# Altium project 1700-0003_PowerBoard_REV-A.PrjPcb
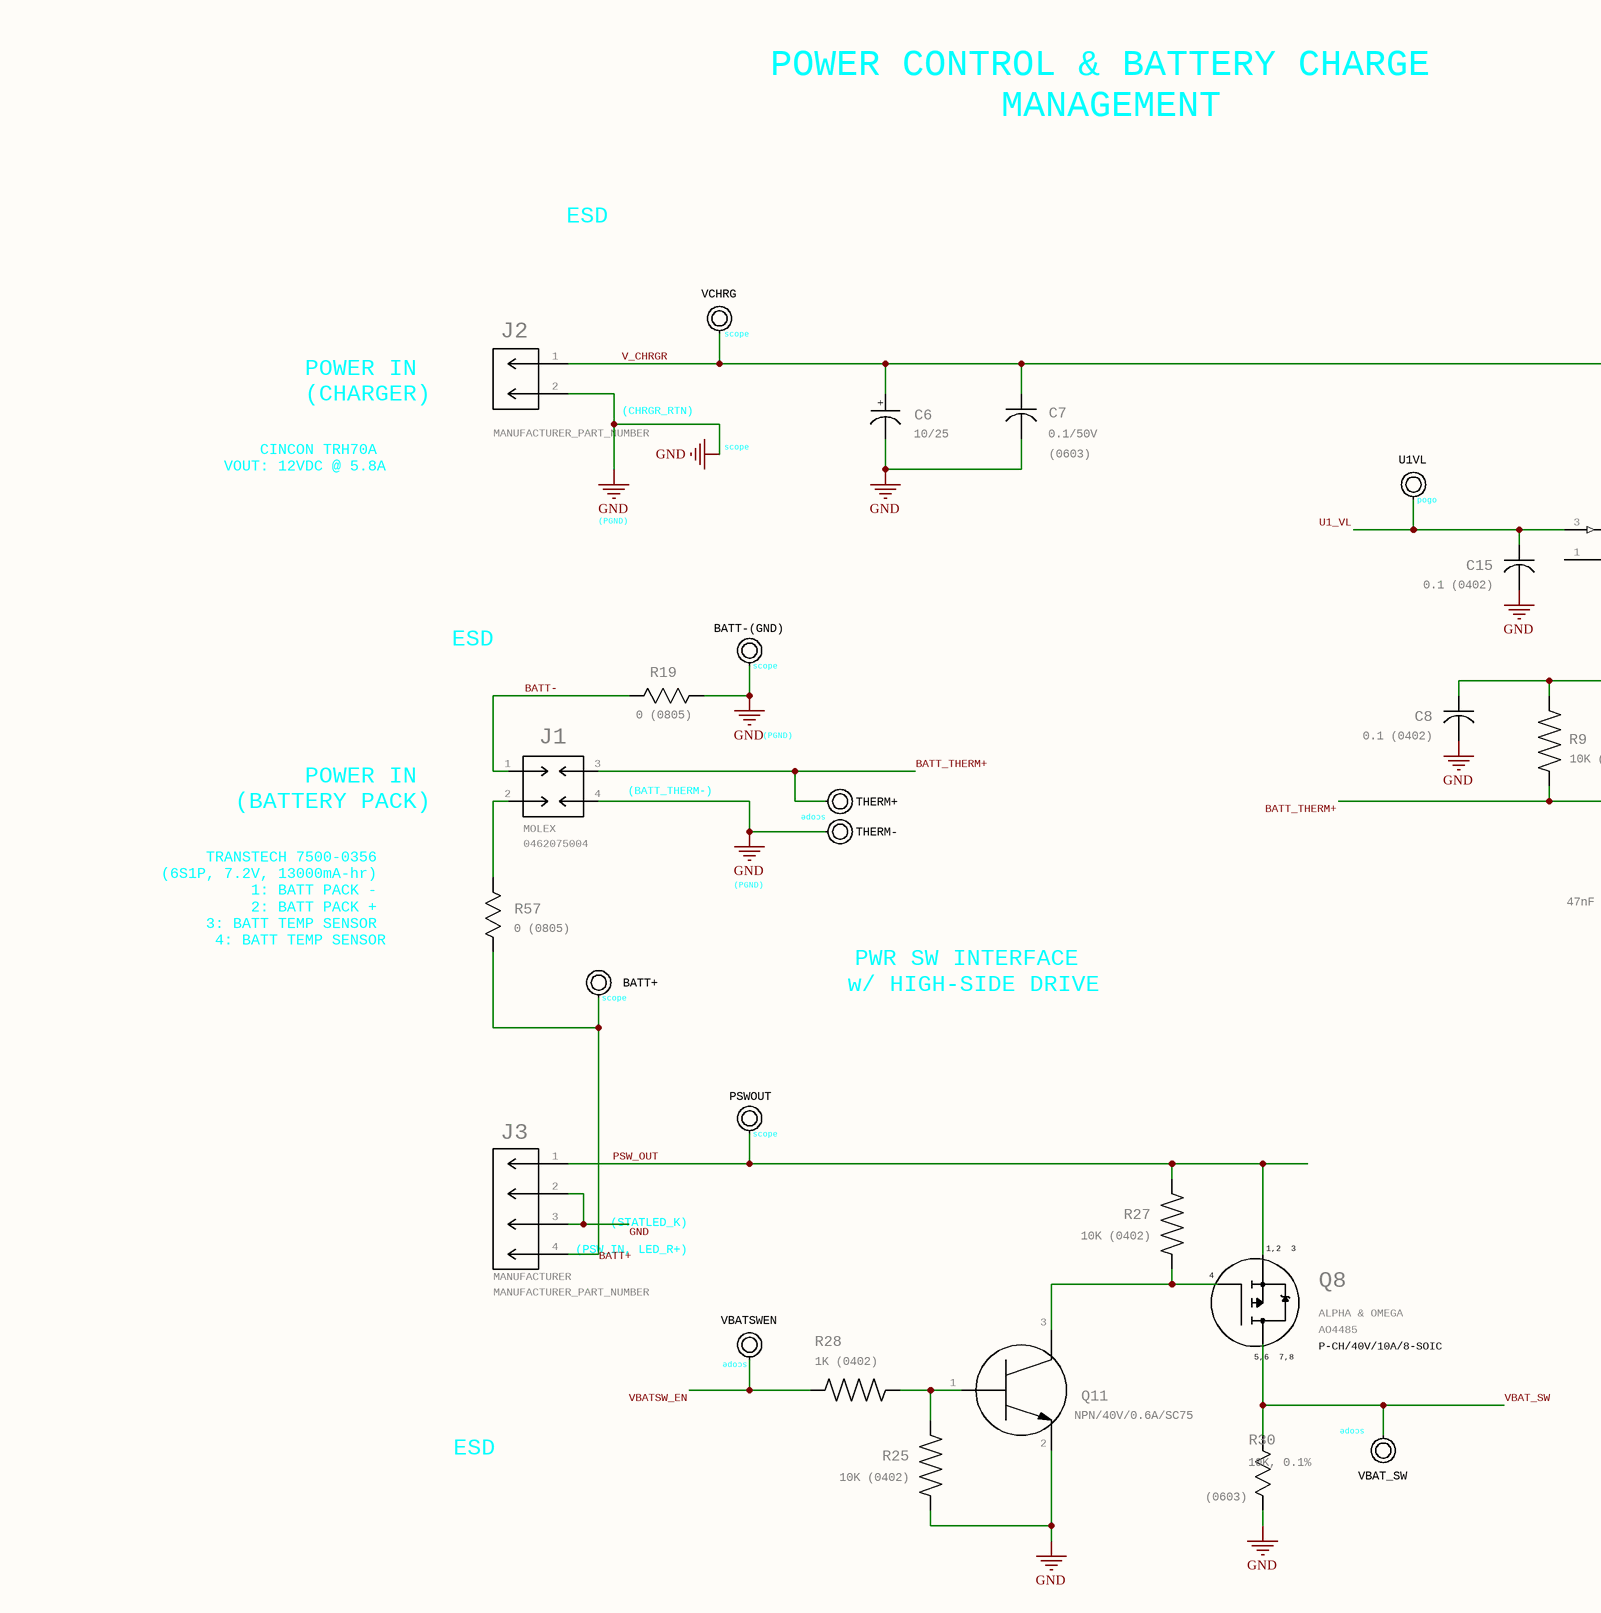
[diagram p0: 1700-0003_PowerBoard_REV-A_0.SchDoc, top left]
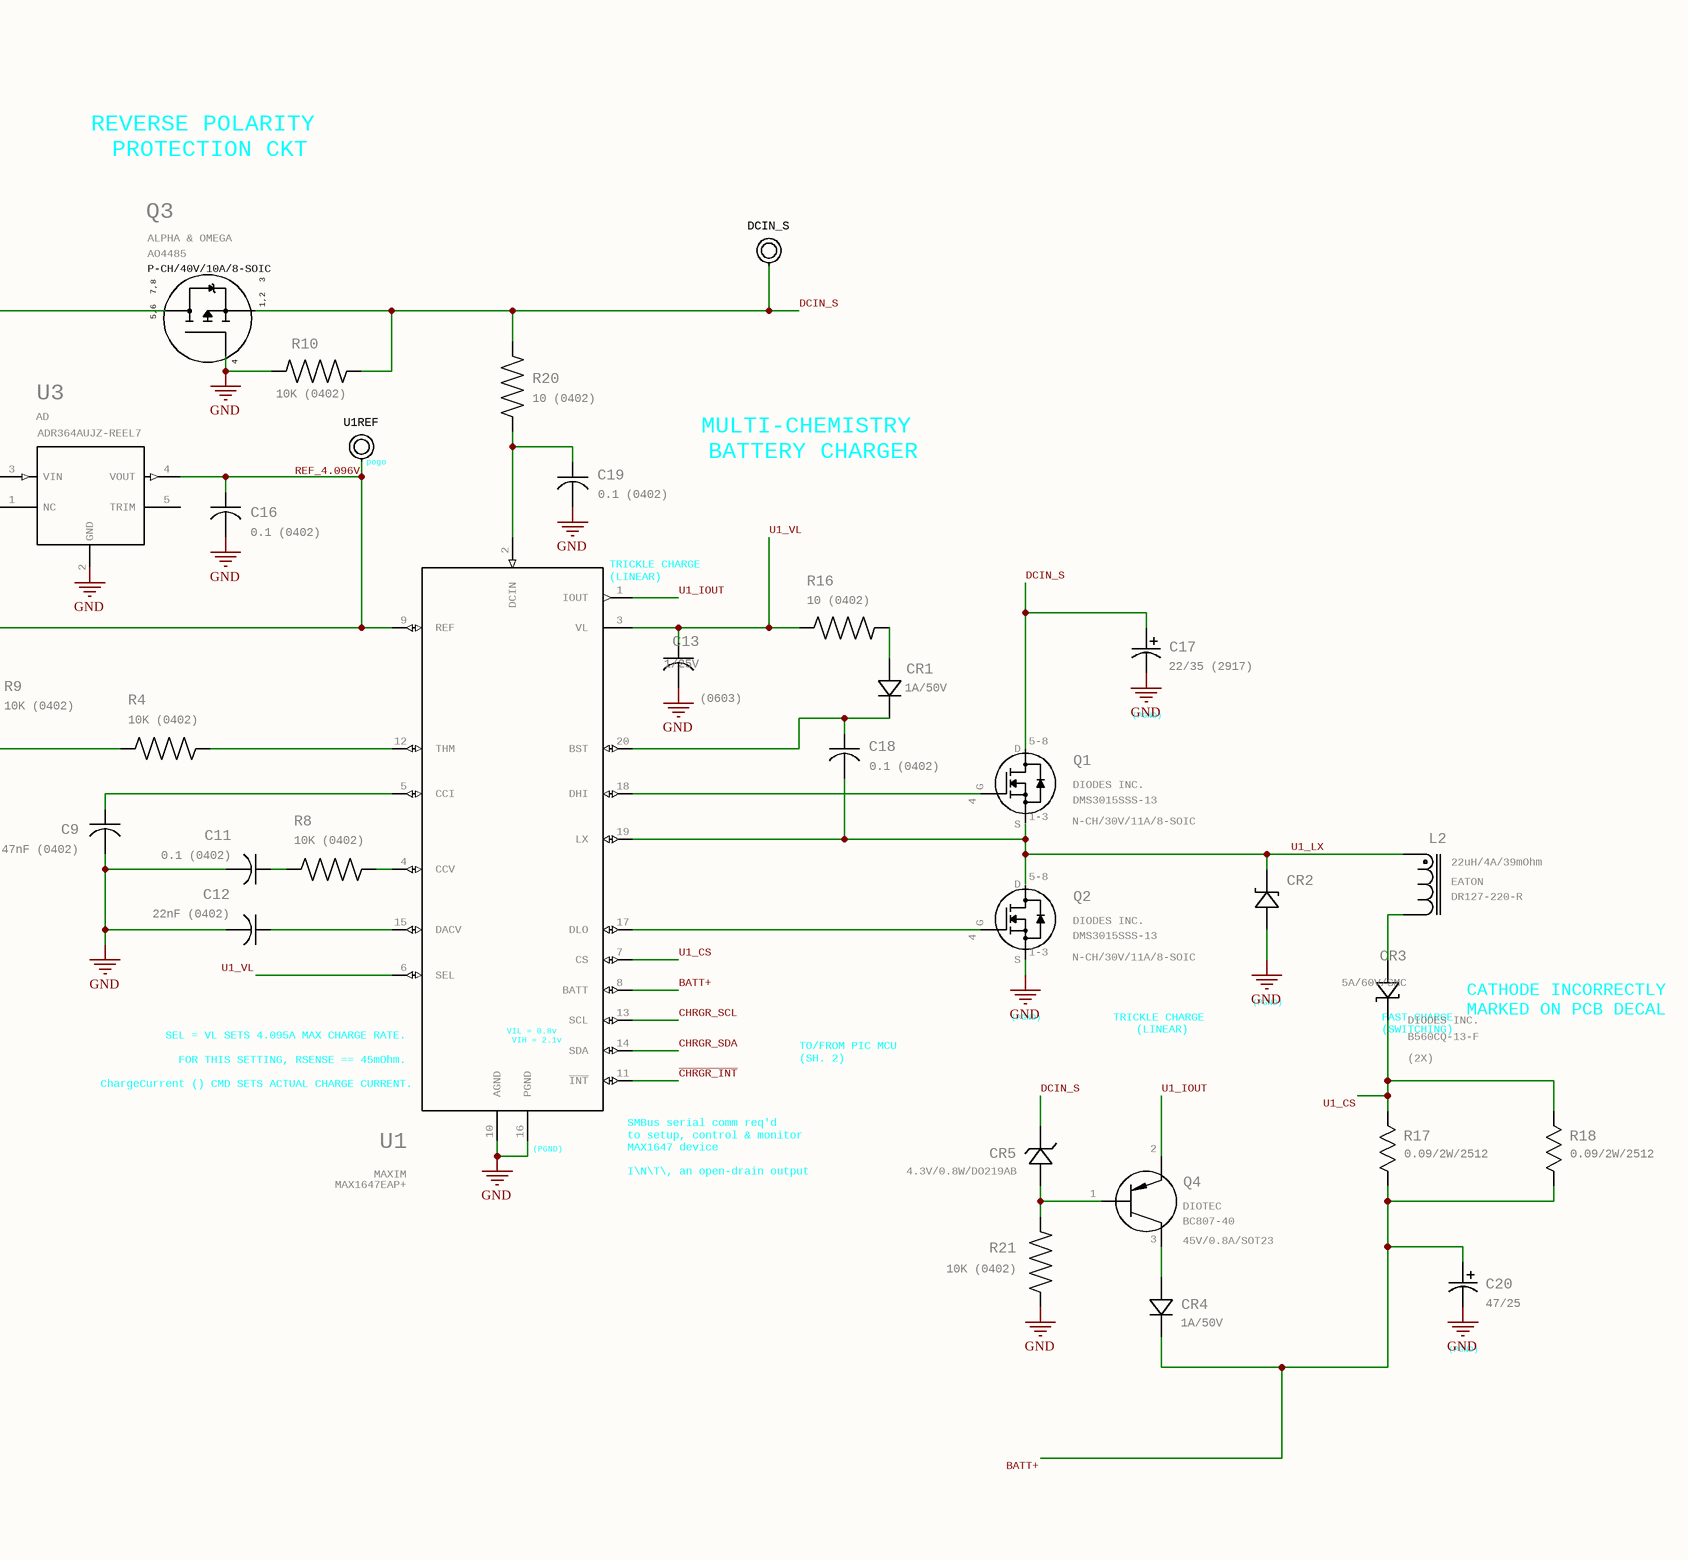
[diagram p1: 1700-0003_PowerBoard_REV-A_0.SchDoc, top middle]
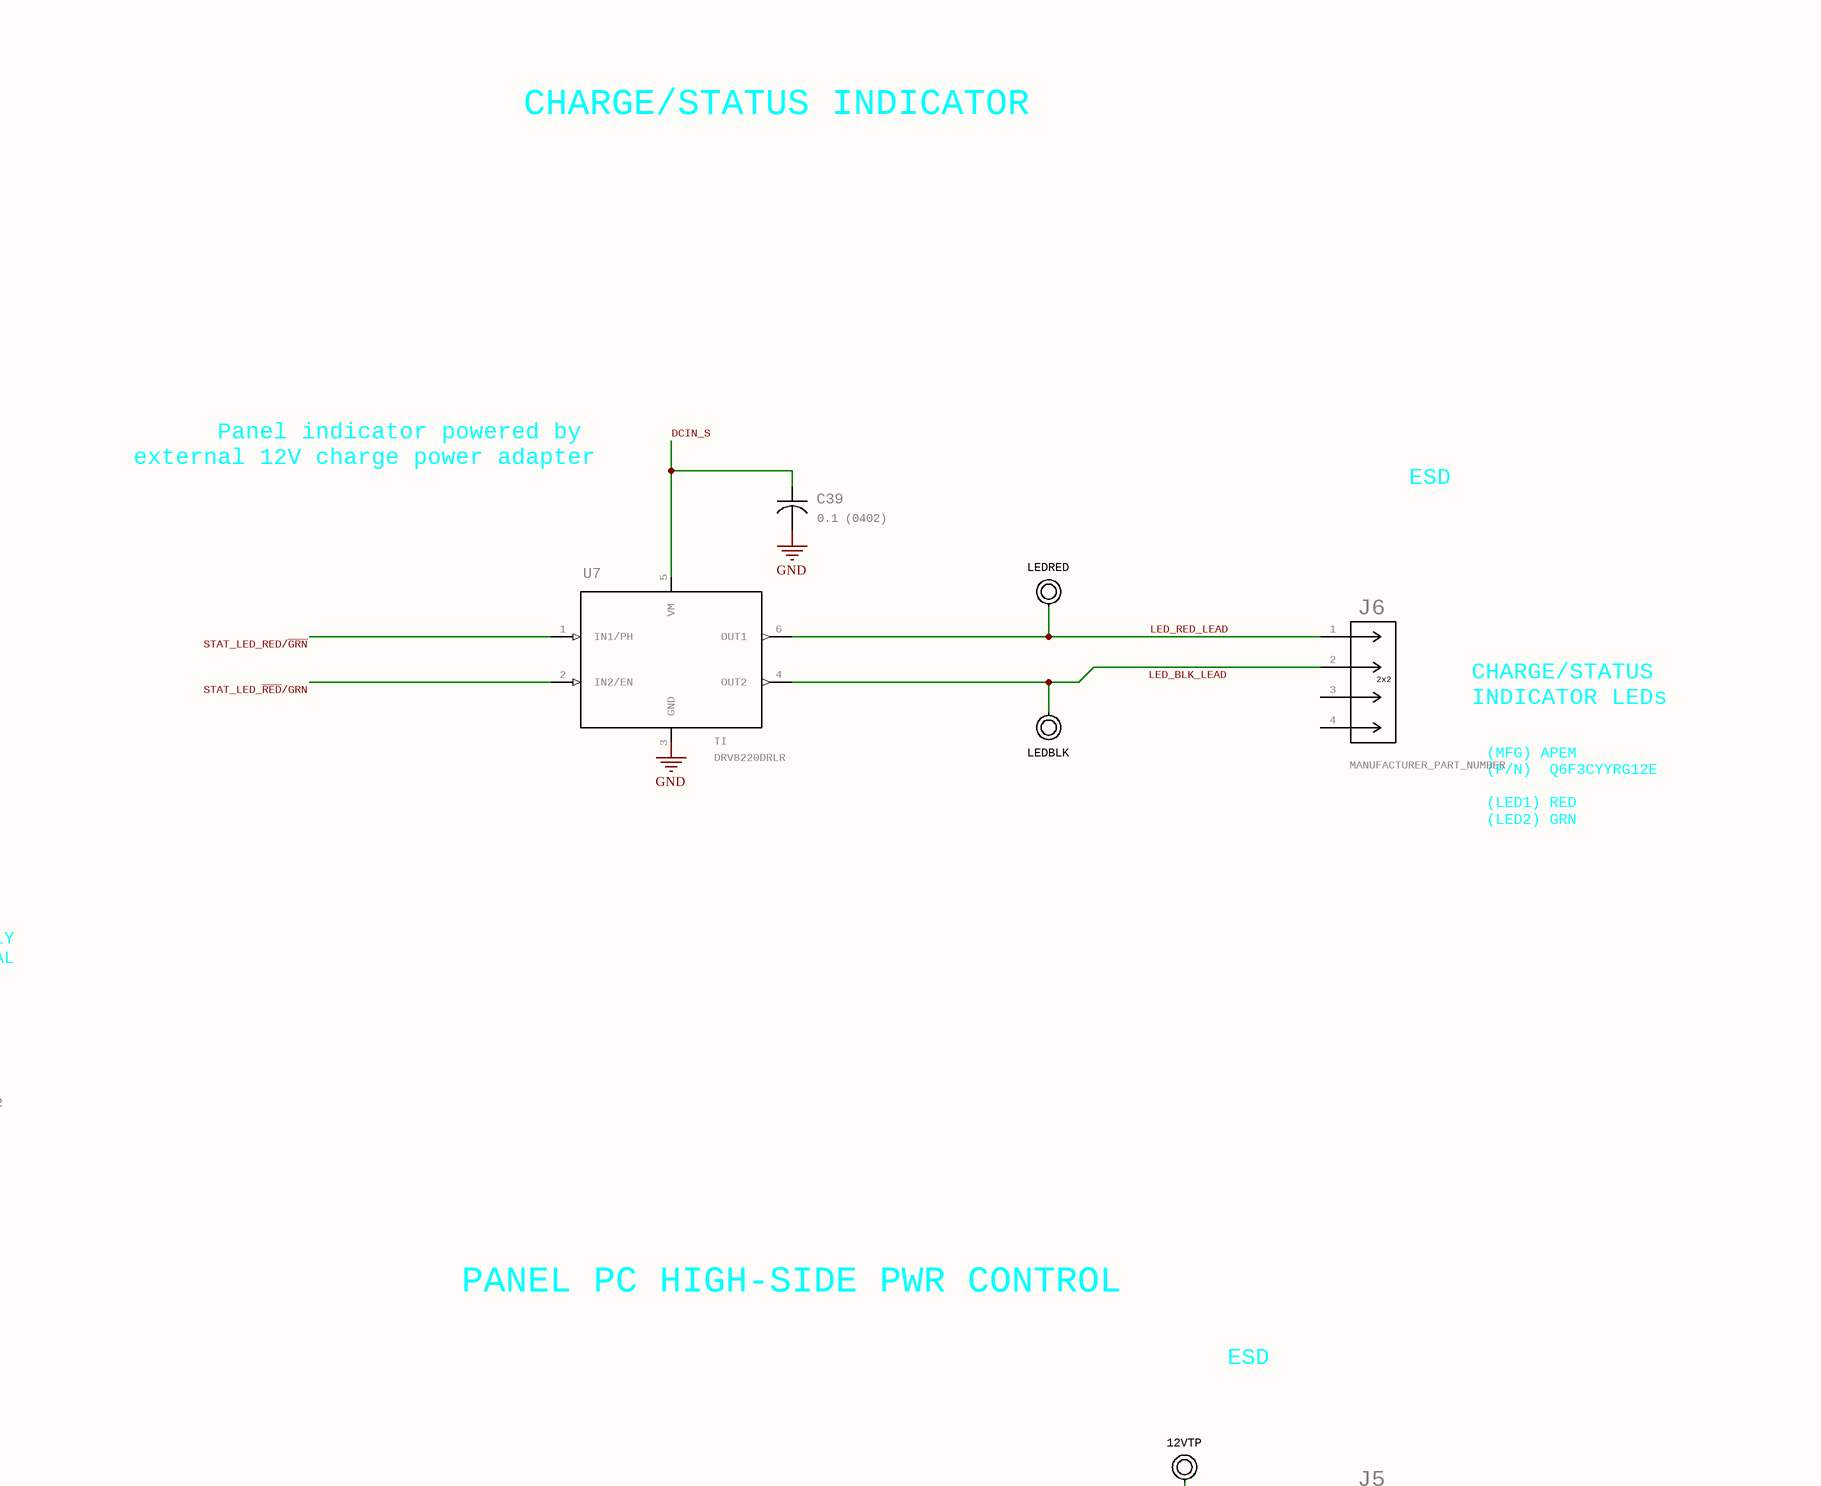
[diagram p2: 1700-0003_PowerBoard_REV-A_0.SchDoc, top right]
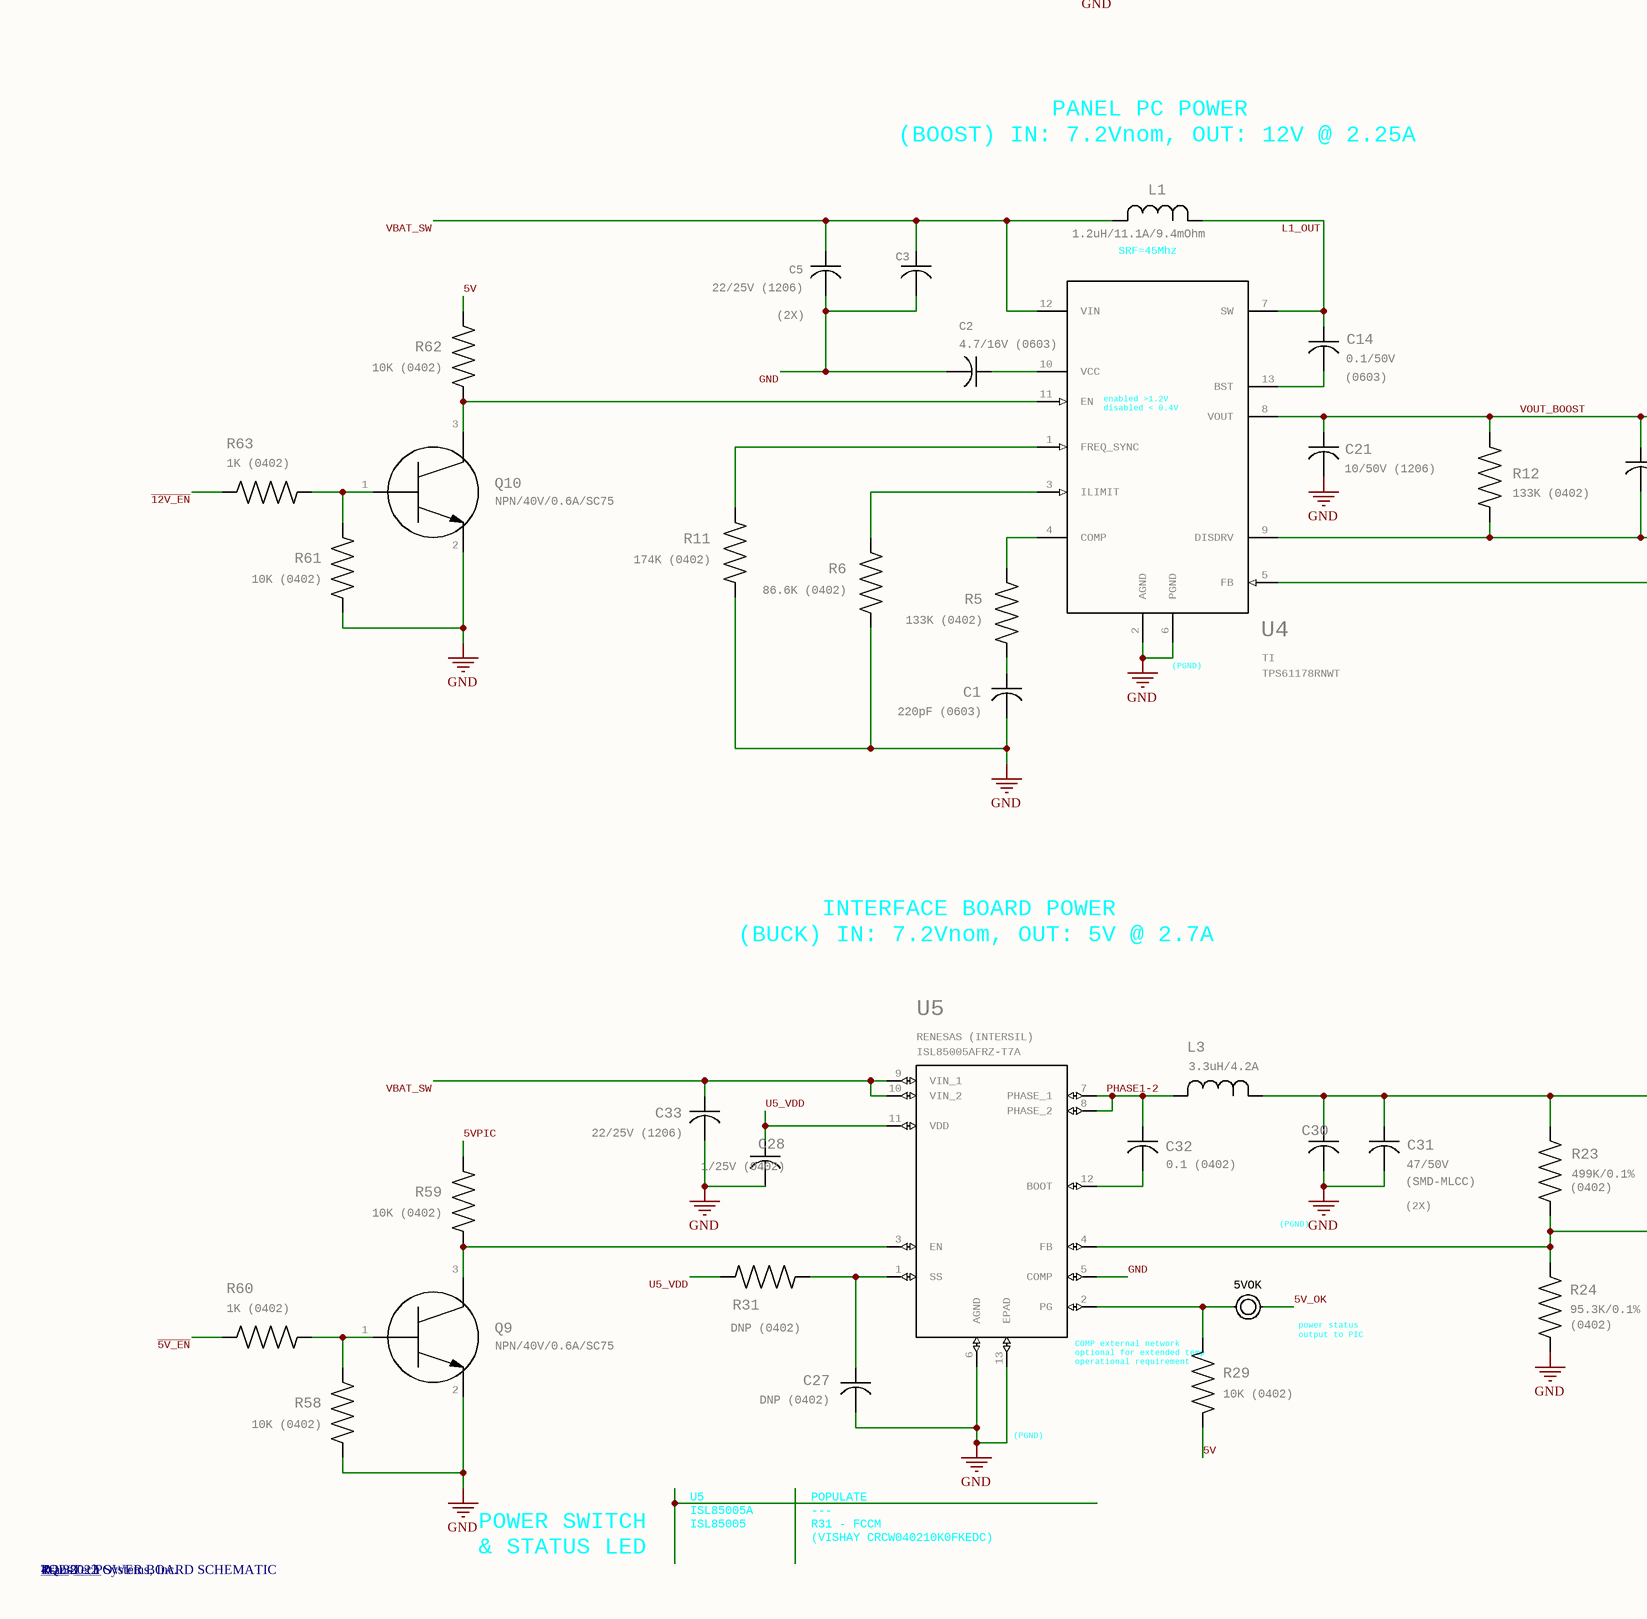
[diagram p3: 1700-0003_PowerBoard_REV-A_0.SchDoc, bottom left]
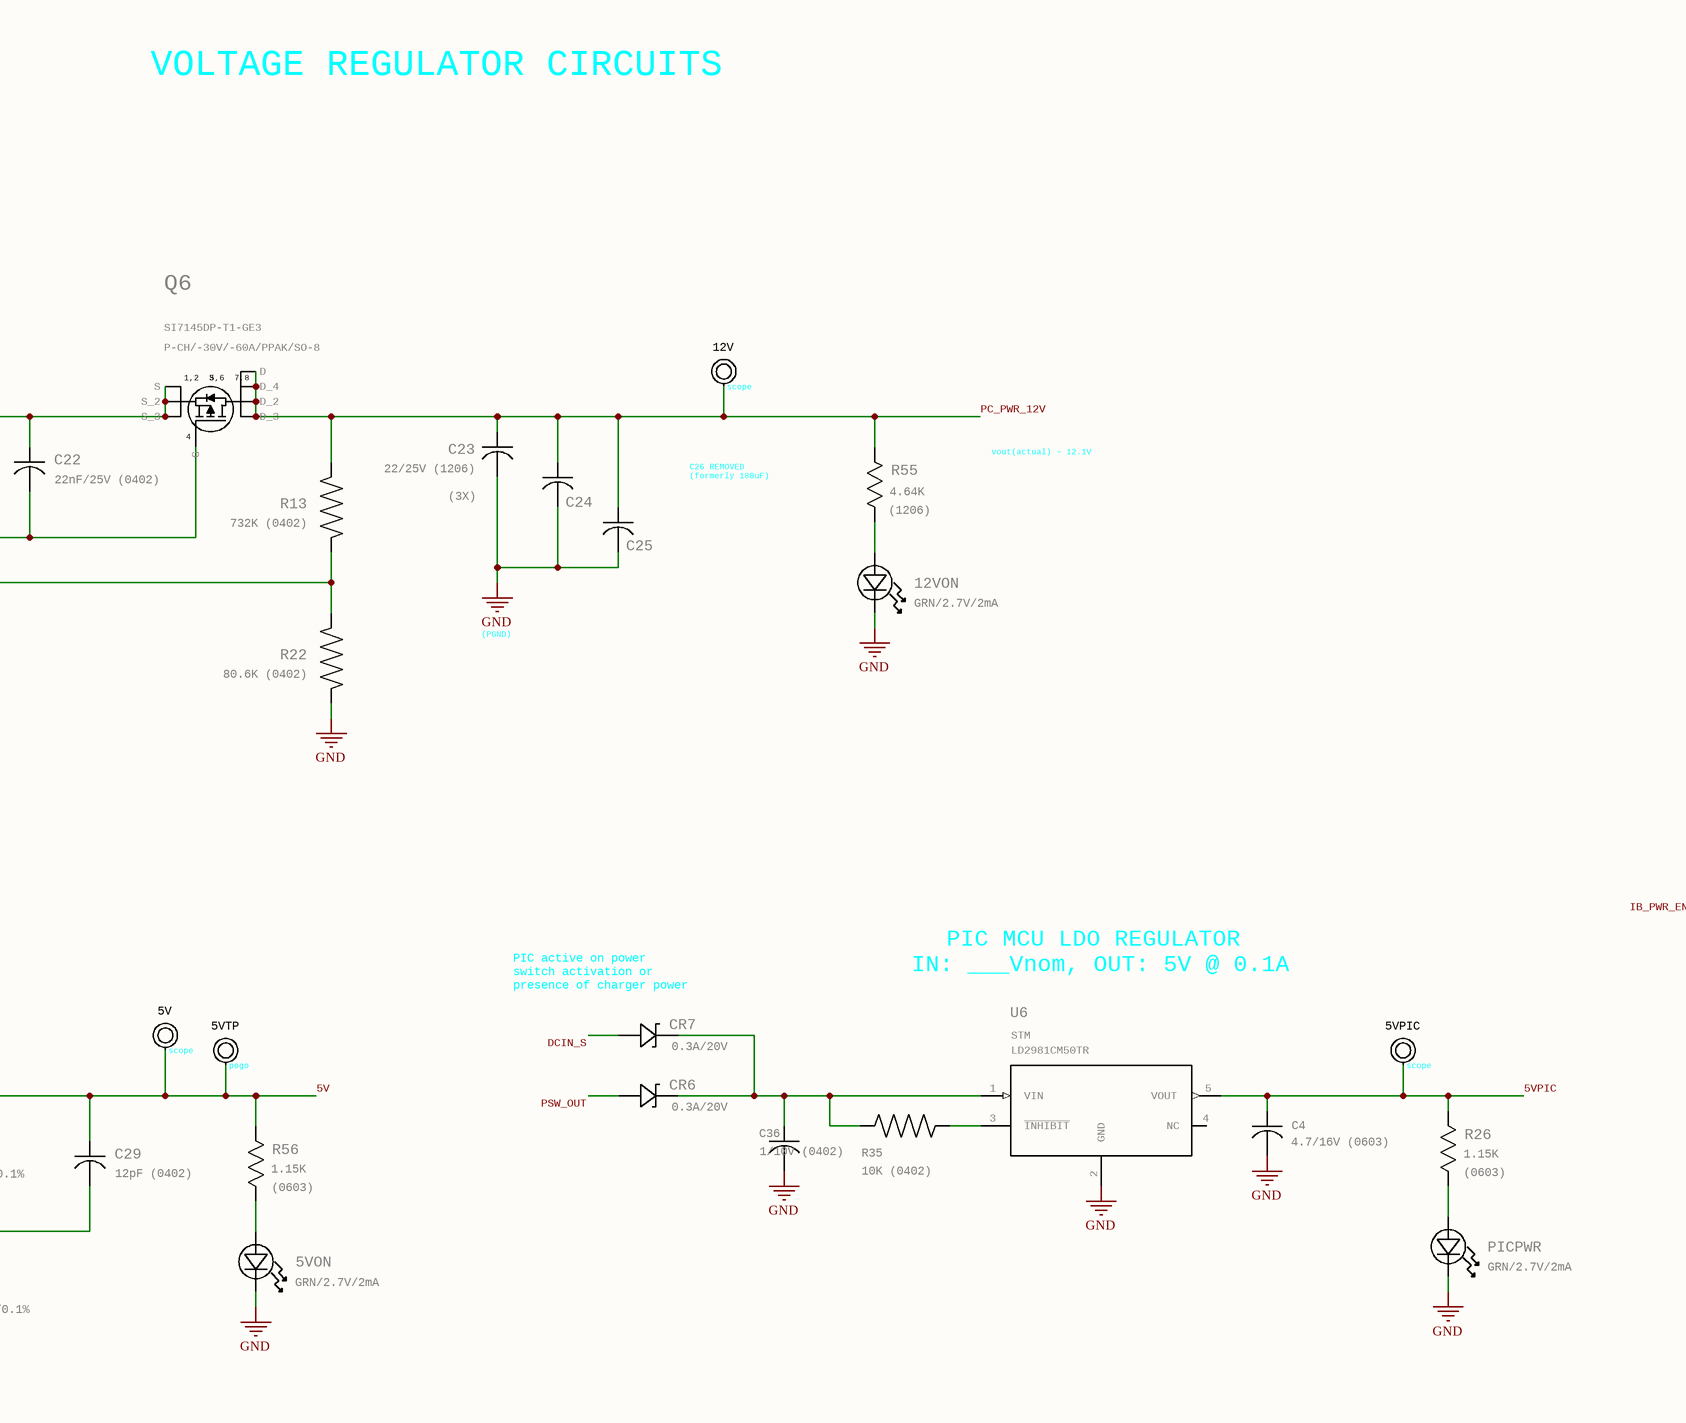
[diagram p4: 1700-0003_PowerBoard_REV-A_0.SchDoc, bottom middle]
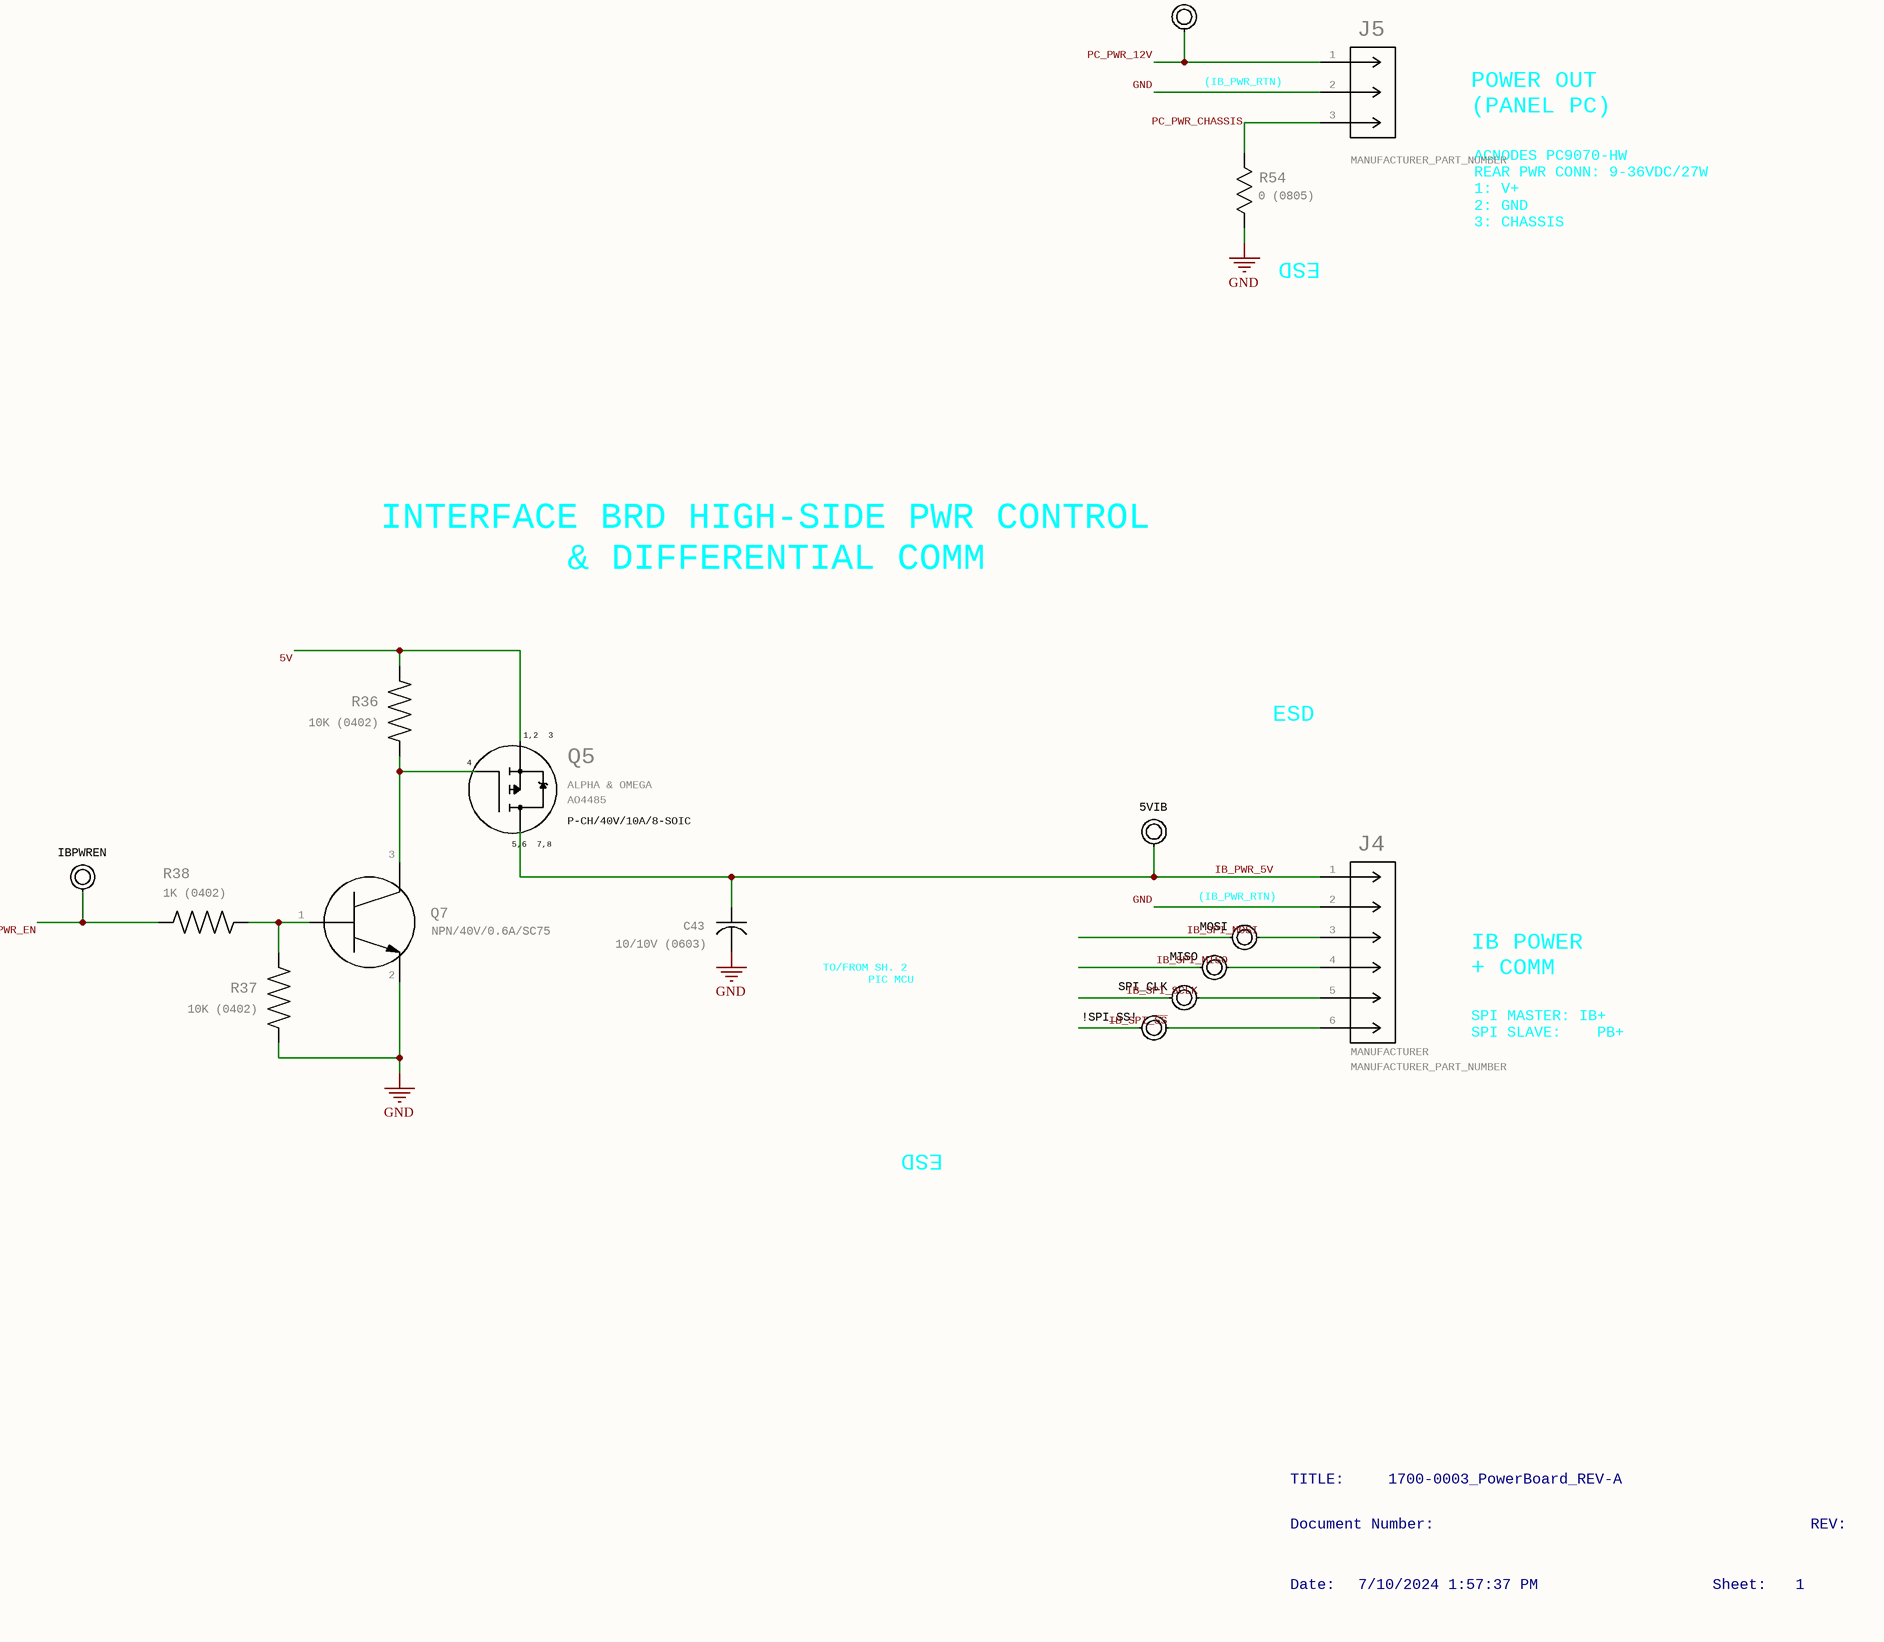
[diagram p5: 1700-0003_PowerBoard_REV-A_0.SchDoc, bottom right]
2 sheets, 204 parts. Net scope: global (net labels, ports and power ports of the same name join across sheets).
Board file: 1700-0003_PowerBoard_REV-A.PcbDoc
Sheets:
  1700-0003_PowerBoard_REV-A_0.SchDoc
  1700-0003_PowerBoard_REV-A_1.SchDoc

## Sheet 1700-0003_PowerBoard_REV-A_0.SchDoc: 1700-0003_PowerBoard_REV-A
size 897 x 577 mm; DRAWING_DATE: 4/15/2022; DRAWING_TITLE: PQI380 UNIV. INTERFACE BRD; PART_NUMBER: 7000-0303; REV: R12; Origin: Eagle; DWG-CO-NAME: DWG-CO-NAME; DWG-DATE: DWG-DATE; DWG-NUMBER: DWG-NUMBER; DWG-REV: DWG-REV; DWG-TITLE: DWG-TITLE; SIZE: SIZE; Date: 7/10/2024 1:57:37 PM; SheetNumber: 1; GateName_1: G$1; SymbolName_1: FRAME_D_L; LibraryName: frames; DeviceSetName: FRAME_D_L; GateName_2: G$2; SymbolName_2: DOCFIELD; Sheet: Sheet:

### Parts
5V  TST_POINT_PTH_042-OCT  [TST_POINT_PTH_042-OCT]  (value not drawn)
5VIB  TST_POINT_PTH_20X40MIL  [TST_POINT_PTH_20X40MIL]  (value not drawn)
5VOK  TST_POINT_PTH_20X40MIL_2PIN  [TST_POINT_PTH_20X40MIL_2PIN]  (value not drawn)
5VON  GRN/2.7V/2mA  [LED_DIALIGHT_598_DIA]
5VPIC  TST_POINT_PTH_042-OCT  [TST_POINT_PTH_042-OCT]  (value not drawn)
5VTP  TST_POINT_PTH_20X40MIL  [TST_POINT_PTH_20X40MIL]  (value not drawn)
12V  TST_POINT_PTH_042-OCT  [TST_POINT_PTH_042-OCT]  (value not drawn)
12VON  GRN/2.7V/2mA  [LED_DIALIGHT_598_DIA]
12VTP  TST_POINT_PTH_20X40MIL  [TST_POINT_PTH_20X40MIL]  (value not drawn)
!SPI_SS!  TST_POINT_PTH_042_2PIN  [TST_POINT_PTH_042-OCT_2PIN]  (value not drawn)
BATT+  TST_POINT_PTH_042-OCT  [TST_POINT_PTH_042-OCT]  (value not drawn)
BATT-(GND)  TST_POINT_PTH_042-OCT  [TST_POINT_PTH_042-OCT]  (value not drawn)
C1  220pF (0603)  [CAP_C1608_TDK]
C2  4.7/16V (0603)  [CAP_C1608_TDK]
C3  22/25V (1206)  [CAP_CL31_SAM]  (value not drawn)
C4  4.7/16V (0603)  [CAP_C1608_TDK]
C5  22/25V (1206)  QTY_AREA: (2X)  [CAP_CL31_SAM]
C6  10/25  [CAP_AFK106M25B12T-F_CND-L]
C7  0.1/50V  PACKAGE: (0603)  [CAP_C1608_TDK]
C8  0.1 (0402)  [G-155_MUR]
C9  47nF (0402)  [G-155_MUR]
C11  0.1 (0402)  [G-155_MUR]
C12  22nF (0402)  [G-155_MUR]
C13  1/25V  PACKAGE: (0603)  [CAP_C1608_TDK]
C14  0.1/50V  PACKAGE: (0603)  [CAP_C1608_TDK]
C15  0.1 (0402)  [G-155_MUR]
C16  0.1 (0402)  [G-155_MUR]
C17  22/35 (2917)  [CAPMP7.6X4.3_3.1N_KEM]
C18  0.1 (0402)  [G-155_MUR]
C19  0.1 (0402)  [G-155_MUR]
C20  47/25  [CAPMP7.6X4.3_3.1N_KEM]
C21  10/50V (1206)  [CAP_CL31_SAM]
C22  22nF/25V (0402)  [G-155_MUR]
C23  22/25V (1206)  QTY_AREA: (3X)  [CAP_CL31_SAM]
C24  22/25V (1206)  [CAP_CL31_SAM]  (value not drawn)
C25  22/25V (1206)  [CAP_CL31_SAM]  (value not drawn)
C27  DNP (0402)  [G-155_MUR]
C28  1/25V (0402)  [G-155_MUR]
C29  12pF (0402)  [G-155_MUR]
C30  47/50V (MLCC-SMD)  [CAP_CKG57N_TDK]  (value not drawn)
C31  47/50V  PACKAGE: (SMD-MLCC)  QTY_AREA: (2X)  [CAP_CKG57N_TDK]
C32  0.1 (0402)  [G-155_MUR]
C33  22/25V (1206)  [CAP_CL31_SAM]
C36  1/10V (0402)  [G-155_MUR]
C39  0.1 (0402)  [G-155_MUR]
C43  10/10V (0603)  [CAP_C1608_TDK]
CR1  1A/50V  [SMA_DIO]
CR2  5A/60V/SMC  [CR_0CQ-13-F_DIO]  (value not drawn)
CR3  5A/60V/SMC  MANUFACTURER: DIODES INC.  MANUFACTURER_PART_NUMBER: B560CQ-13-F  QTY_AREA: (2X)  [CR_0CQ-13-F_DIO]
CR4  1A/50V  [SMA_DIO]
CR5  4.3V/0.8W/DO219AB  [DIO_BZD27C4V3P_VIS]
CR6  0.3A/20V  [USC_TOS]
CR7  0.3A/20V  [USC_TOS]
DCIN_S  TST_POINT_PTH_042-OCT  [TST_POINT_PTH_042-OCT]  (value not drawn)
IBPWREN  TST_POINT_PTH_042-OCT  [TST_POINT_PTH_042-OCT]  (value not drawn)
J1  MANUFACTURER: MOLEX  MANUFACTURER_PART_NUMBER: 0462075004  [MOLEX_462075004]  (hidden comment: MOLEX_MINI-FIT-JR_462075004)
J2  MOLEX_NANO-FIT_1053111302  [CON_1053111302_MOL]  (value not drawn)
J3  MOLEX_NANO-FIT_1053111304  [CON_1053111304_MOL]  (value not drawn)
J4  MOLEX_1053111206  [CON_1053111206_MOL]  (value not drawn)
J5  MOLEX_NANO-FIT_1053111303  [CON_1053111303_MOL]  (value not drawn)
J6  CON_MOLEX_NANOFIT_1053121304  [CON_1053121304]  (value not drawn)
L1  1.2uH/11.1A/9.4mOhm  [IND_XAL50XX_COC]
L2  22uH/4A/39mOhm  MANUFACTURER: EATON  MANUFACTURER_PART_NUMBER: DR127-220-R  [DR127]
L3  3.3uH/4.2A  [IND_CB_DRA74]
LEDBLK  TST_POINT_PTH_20X40MIL  [TST_POINT_PTH_20X40MIL]  (value not drawn)
LEDRED  TST_POINT_PTH_20X40MIL  [TST_POINT_PTH_20X40MIL]  (value not drawn)
MISO  TST_POINT_PTH_042_2PIN  [TST_POINT_PTH_042-OCT_2PIN]  (value not drawn)
MOSI  TST_POINT_PTH_042_2PIN  [TST_POINT_PTH_042-OCT_2PIN]  (value not drawn)
PICPWR  GRN/2.7V/2mA  [LED_DIALIGHT_598_DIA]
PSWOUT  TST_POINT_PTH_042-OCT  [TST_POINT_PTH_042-OCT]  (value not drawn)
Q1  N-CH/30V/11A/8-SOIC  MANUFACTURER: DIODES INC.  MANUFACTURER_PART_NUMBER: DMS3015SSS-13  [SOIC127P600X175-8N]
Q2  N-CH/30V/11A/8-SOIC  MANUFACTURER: DIODES INC.  MANUFACTURER_PART_NUMBER: DMS3015SSS-13  [SOIC127P600X175-8N]
Q3  P-CH/40V/10A/8-SOIC  5,6
7,8: 5,6 / 7,8  1,2
3: 1,2 / 3  MANUFACTURER: ALPHA & OMEGA  MANUFACTURER_PART_NUMBER: AO4485  [SOIC127P600X175-8N]
Q4  45V/0.8A/SOT23  MANUFACTURER: DIOTEC  MANUFACTURER_PART_NUMBER: BC807-40  [SOT-23-3_DIOTEC]
Q5  P-CH/40V/10A/8-SOIC  5,6
7,8: 5,6 / 7,8  1,2
3: 1,2 / 3  MANUFACTURER: ALPHA & OMEGA  MANUFACTURER_PART_NUMBER: AO4485  [SOIC127P600X175-8N]
Q6  P-CH/-30V/-60A/PPAK/SO-8  5,6
7,8: 5,6 / 7,8  1,2
3: 1,2 / 3  MANUFACTURER_PART_NUMBER: SI7145DP-T1-GE3  [SON8_SI7135DP-T1-GE3_VIS]
Q7  NPN/40V/0.6A/SC75  [SC-75(SOT-416)_ONSEMI]
Q8  P-CH/40V/10A/8-SOIC  5,6
7,8: 5,6 / 7,8  1,2
3: 1,2 / 3  MANUFACTURER: ALPHA & OMEGA  MANUFACTURER_PART_NUMBER: AO4485  [SOIC127P600X175-8N]
Q9  NPN/40V/0.6A/SC75  [SC-75(SOT-416)_ONSEMI]
Q10  NPN/40V/0.6A/SC75  [SC-75(SOT-416)_ONSEMI]
Q11  NPN/40V/0.6A/SC75  [SC-75(SOT-416)_ONSEMI]
R4  10K (0402)  [RESC1005X35N]
R5  133K (0402)  [RESC1005X35N]
R6  86.6K (0402)  [RESC1005X35N]
R8  10K (0402)  [RESC1005X35N]
R9  10K (0402)  [RESC1005X35N]
R10  10K (0402)  [RESC1005X35N]
R11  174K (0402)  [RESC1005X35N]
R12  133K (0402)  [RESC1005X35N]
R13  732K (0402)  [RESC1005X35N]
R16  10 (0402)  [RESC1005X35N]
R17  0.09/2W/2512  [RES_2512_TECONN]
R18  0.09/2W/2512  [RES_2512_TECONN]
R19  0 (0805)  [STA_HCJ0805_STP]
R20  10 (0402)  [RESC1005X35N]
R21  10K (0402)  [RESC1005X35N]
R22  80.6K (0402)  [RESC1005X35N]
R23  499K/0.1%  PACKAGE: (0402)  [RESC1005X35N]
R24  95.3K/0.1%  PACKAGE: (0402)  [RESC1005X35N]
R25  10K (0402)  [RESC1005X35N]
R26  1.15K  PACKAGE: (0603)  [STA_RMCF0603_STP]
R27  10K (0402)  [RESC1005X35N]
R28  1K (0402)  [RESC1005X35N]
R29  10K (0402)  [RESC1005X35N]
R30  10K, 0.1%  PACKAGE: (0603)  [STA_RMCF0603_STP]
R31  DNP (0402)  [RESC1005X35N]
R35  10K (0402)  [RESC1005X35N]
R36  10K (0402)  [RESC1005X35N]
R37  10K (0402)  [RESC1005X35N]
R38  1K (0402)  [RESC1005X35N]
R54  0 (0805)  [STA_HCJ0805_STP]
R55  4.64K  PACKAGE: (1206)  [RC1206N_YAG]
R56  1.15K  PACKAGE: (0603)  [STA_RMCF0603_STP]
R57  0 (0805)  [STA_HCJ0805_STP]
R58  10K (0402)  [RESC1005X35N]
R59  10K (0402)  [RESC1005X35N]
R60  1K (0402)  [RESC1005X35N]
R61  10K (0402)  [RESC1005X35N]
R62  10K (0402)  [RESC1005X35N]
R63  1K (0402)  [RESC1005X35N]
SPI_CLK  TST_POINT_PTH_042_2PIN  [TST_POINT_PTH_042-OCT_2PIN]  (value not drawn)
THERM+  TST_POINT_PTH_042-OCT  [TST_POINT_PTH_042-OCT]  (value not drawn)
THERM-  TST_POINT_PTH_042-OCT  [TST_POINT_PTH_042-OCT]  (value not drawn)
U1  MANUFACTURER: MAXIM  [21-0056C_20_MXM]  (hidden comment: MAX1647EAP+)
U1REF  TST_POINT_PTH_20X40MIL  [TST_POINT_PTH_20X40MIL]  (value not drawn)
U1VL  TST_POINT_PTH_20X40MIL  [TST_POINT_PTH_20X40MIL]  (value not drawn)
U3  MANUFACTURER: AD  MANUFACTURER_PART_NUMBER: ADR364AUJZ-REEL7  [UJ_5_ADI]  (hidden comment: AD_REFERENCE_ADR364AUJZ-REEL7)
U4  MANUFACTURER: TI  MANUFACTURER_PART_NUMBER: TPS61178RNWT  [RNW0013A]  (hidden comment: REGULATOR_BOOST_TI_TPS61178RNWT)
U5  MANUFACTURER: RENESAS (INTERSIL)  MANUFACTURER_PART_NUMBER: ISL85005AFRZ-T7A  [SON50P300X400X90-13N]  (hidden comment: REGULATOR_BUCK_RENESAS_ISL85005AFRZ-T7A)
U6  MANUFACTURER: STM  MANUFACTURER_PART_NUMBER: LD2981CM50TR  [SOT23-5L_STM]  (hidden comment: IC_LDO_STM_LD2981CM50TR)
U7  MANUFACTURER: TI  MANUFACTURER_PART_NUMBER: DRV8220DRLR  [SOT5X3-6_DRL_TEX]  (hidden comment: IC_H-BRIDGE_TI_DRV8220DRLR)
VBAT_SW  TST_POINT_PTH_042-OCT  [TST_POINT_PTH_042-OCT]  (value not drawn)
VBATSWEN  TST_POINT_PTH_042-OCT  [TST_POINT_PTH_042-OCT]  (value not drawn)
VCHRG  TST_POINT_PTH_042-OCT  [TST_POINT_PTH_042-OCT]  (value not drawn)

### Nets
GND: 5VON.1 12VON.1 BATT-(GND).P$1 C1.2 C2.2 C3.2 C4.2 C5.2 C6.2 C7.2 C8.2 C9.2 C11.2 C12.2 C13.2 C15.2 C16.2 C17.2 C19.2 C20.2 C21.2 C23.2 C24.2 C25.2 C27.2 C28.2 C30.2 C31.2 C33.2 C36.2 C39.2 C43.2 CR2.1(A) J1.4 J2.2 J3.2 J3.3 J4.2 J5.2 PICPWR.1 Q2.1-3(S) Q3.4(G) Q7.2(E) Q9.2(E) Q10.2(E) Q11.2(E) R6.2 R10.1 R11.2 R19.1 R21.2 R22.2 R24.2 R25.1 R30.2 R37.1 R54.2 R58.1 R61.1 THERM-.P$1 U1.10(AGND) U1.16(PGND) U3.2(GND) U4.2(AGND) U4.6(PGND) U5.5(COMP) U5.6(AGND) U5.13(EPAD) U6.2(GND) U7.3(GND)
~{12V_EN}: R63.1
~{5V_EN}: R60.1
5V: 5V.P$1 5VTP.P$1 C29.1 C30.1 C31.1 L3.1 Q5.1-3(S) R23.1 R29.1 R36.2 R56.2 R62.2
5V_OK: 5VOK.P$1
5VPIC: 5VPIC.P$1 C4.1 R26.2 R59.2 U6.5(VOUT)
BATT+: BATT+.P$1 C20.1 CR4.1 J3.4 R17.2 R18.2 R57.1 U1.8(BATT)
BATT-: J1.1 R19.2
BATT_THERM+: J1.3 R4.1 R9.2 THERM+.P$1
~{CHRGR_INT}: U1.11(~{INT})
CHRGR_SCL: U1.13(SCL)
CHRGR_SDA: U1.14(SDA)
DCIN_S: C17.1 C39.1 CR5.2(K) CR7.2(A) DCIN_S.P$1 Q1.5-8(D) Q3.1-3(S) R10.2 R20.2 U7.5(VM)
IB_PWR_5V: 5VIB.P$1 C43.1 J4.1 Q5.5-8(D)
IB_PWR_EN: IBPWREN.P$1 R38.1
IB_SPI_MISO: J4.4 MISO.P$1
IB_SPI_MOSI: J4.3 MOSI.P$1
IB_SPI_~{SS}: !SPI_SS!.P$1 J4.6
IB_SPI_SCLK: J4.5 SPI_CLK.P$1
L1_OUT: C14.1 L1.1 U4.7(SW)
LED_BLK_LEAD: J6.2 LEDBLK.P$1 U7.4(OUT2)
LED_RED_LEAD: J6.1 LEDRED.P$1 U7.6(OUT1)
PC_PWR_12V: 12V.P$1 12VTP.P$1 C23.1 C24.1 C25.1 J5.1 Q6.5(D_3) Q6.6(D_2) Q6.7(D_4) Q6.8(D) R13.1 R55.1
PC_PWR_CHASSIS: J5.3 R54.1
PHASE1-2: C32.1 L3.2 U5.7(PHASE_1) U5.8(PHASE_2)
PSW_OUT: CR6.2(A) J3.1 PSWOUT.P$1 Q8.1-3(S) R27.2
REF_4.096V: C8.1 C16.1 R9.1 U1.9(REF) U1REF.P$1 U3.4(VOUT)
STAT_LED_~{RED}/GRN: U7.2(IN2/EN)
STAT_LED_RED/~{GRN}: U7.1(IN1/PH)
U1_CS: CR3.2(K) R17.1 R18.1 U1.7(CS)
U1_IOUT: Q4.2(E) U1.1(IOUT)
U1_LX: C18.2 CR2.2(K) L2.1 Q1.1-3(S) Q2.5-8(D) U1.19(LX)
U1_VL: C13.1 C15.1 R16.1 U1.3(VL) U1.6(SEL) U1VL.P$1 U3.3(VIN)
U5_VDD: C28.1 R31.1 U5.11(VDD)
V_CHRGR: C6.1 C7.1 J2.1 Q3.5-8(D) VCHRG.P$1
VBAT_SW: C3.1 C5.1 C33.1 L1.2 Q8.5-8(D) R30.1 U4.12(VIN) U5.9(VIN_1) U5.10(VIN_2) VBAT_SW.P$1
VBATSW_EN: R28.1 VBATSWEN.P$1
VOUT_BOOST: C21.1 C22.1 Q6.1(S_3) Q6.2(S_2) Q6.3(S) R12.1 U4.8(VOUT)
Net5VOK_P$2: 5VOK.P$2 R29.2 U5.2(PG)
Net5VON_2: 5VON.2 R56.1
Net12VON_2: 12VON.2 R55.2
NetC1_1: C1.1 R5.2
NetC2_1: C2.1 U4.10(VCC)
NetC9_1: C9.1 U1.5(CCI)
NetC11_1: C11.1 R8.1
NetC12_1: C12.1 U1.15(DACV)
NetC14_2: C14.2 U4.13(BST)
NetC18_1: C18.1 CR1.1 U1.20(BST)
NetC19_1: C19.1 R20.1 U1.2(DCIN)
NetC22_2: C22.2 Q6.4(G) R12.2 U4.9(DISDRV)
NetC27_1: C27.1 R31.2 U5.1(SS)
NetC29_2: C29.2 R23.2 R24.1 U5.4(FB)
NetC32_2: C32.2 U5.12(BOOT)
NetC36_1: C36.1 CR6.1(K) CR7.1(K) R35.2 U6.1(VIN)
NetCR1_2: CR1.2 R16.2
NetCR3_1: CR3.1(A) L2.2
NetCR4_2: CR4.2 Q4.3(C)
NetCR5_1: CR5.1(A) Q4.1(B) R21.1
NetJ1_2: J1.2 R57.2
NetPICPWR_2: PICPWR.2 R26.1
NetQ1_4: Q1.4(G) U1.18(DHI)
NetQ2_4: Q2.4(G) U1.17(DLO)
NetQ5_4: Q5.4(G) Q7.3(C) R36.1
NetQ7_1: Q7.1(B) R37.2 R38.2
NetQ8_4: Q8.4(G) Q11.3(C) R27.1
NetQ9_1: Q9.1(B) R58.2 R60.2
NetQ9_3: Q9.3(C) R59.1 U5.3(EN)
NetQ10_1: Q10.1(B) R61.2 R63.2
NetQ10_3: Q10.3(C) R62.1 U4.11(EN)
NetQ11_1: Q11.1(B) R25.2 R28.2
NetR4_2: R4.2 U1.12(THM)
NetR5_1: R5.1 U4.4(COMP)
NetR6_1: R6.1 U4.3(ILIMIT)
NetR8_2: R8.2 U1.4(CCV)
NetR11_1: R11.1 U4.1(FREQ_SYNC)
NetR13_2: R13.2 R22.1 U4.5(FB)
NetR35_1: R35.1 U6.3(~{INHIBIT})

Not connected (* = marked no-connect by the designer): !SPI_SS! P$2; J6 3 4; MISO P$2; MOSI P$2; SPI_CLK P$2; U3 1(NC) 5(TRIM); U6 4(NC)

### Notes on the sheet
- POWER CONTROL & BATTERY CHARGE
  MANAGEMENT
- ESD
- REVERSE POLARITY
  PROTECTION CKT
- CHARGE/STATUS INDICATOR
- (near VCHRG) scope
- POWER IN
  (CHARGER)
- (CHRGR_RTN)
- scope
- CINCON TRH70A
  VOUT: 12VDC @ 5.8A
- (PGND)
- (near U1VL) pogo
- (near U1REF) pogo
- MULTI-CHEMISTRY
  BATTERY CHARGER
- Panel indicator powered by
  external 12V charge power adapter
- (near BATT-(GND)) scope
- (near U1) TRICKLE CHARGE
  (LINEAR)
- POWER IN
  (BATTERY PACK)
- (near J1) (BATT_THERM-)
- (near C17) (PGND)
- CHARGE/STATUS
  INDICATOR LEDs
- TRANSTECH 7500-0356
  (6S1P, 7.2V, 13000mA-hr)
  1: BATT PACK -
  2: BATT PACK +
  3: BATT TEMP SENSOR
  4: BATT TEMP SENSOR
- (MFG) APEM
  (P/N)  Q6F3CYYRG12E
  (LED1) RED
  (LED2) GRN
- (near BATT+) scope
- PWR SW INTERFACE
  w/ HIGH-SIDE DRIVE
- (near U1) VIL = 0.8v
  VIH = 2.1v
- TO/FROM PIC MCU
  (SH. 2)
- (near Q2) (PGND)
- TRICKLE CHARGE
  (LINEAR)
- (near CR3) FAST CHARGE
  (SWITCHING)
- CATHODE INCORRECTLY
  MARKED ON PCB DECAL
- (near PSWOUT) scope
- (near U1) SEL = VL SETS 4.095A MAX CHARGE RATE.
  FOR THIS SETTING, RSENSE == 45mOhm.
  ChargeCurrent () CMD SETS ACTUAL CHARGE CURRENT.
- (near U1) (PGND)
- (STATLED_K)
- (PSW_IN, LED_R+)
- (near U1) SMBus serial comm req'd
  to setup, control & monitor
  MAX1647 device
  I\N\T\, an open-drain output
- (near VBATSWEN) scope
- (near VBAT_SW) scope
- (near C20) (PGND)
- PANEL PC HIGH-SIDE PWR CONTROL
- VOLTAGE REGULATOR CIRCUITS
- (IB_PWR_RTN)
- PANEL PC POWER
  (BOOST) IN: 7.2Vnom, OUT: 12V @ 2.25A
- POWER OUT
  (PANEL PC)
- (near R54) ESD
- ACNODES PC9070-HW
  REAR PWR CONN: 9-36VDC/27W
  1: V+
  2: GND
  3: CHASSIS
- (near L1) SRF=45Mhz
- (near U4) enabled >1.2V
  disabled < 0.4V
- (near 12V) scope
- vout(actual) ~ 12.1V
- C26 REMOVED
  (formerly 180uF)
- INTERFACE BRD HIGH-SIDE PWR CONTROL
  & DIFFERENTIAL COMM
- (near U4) (PGND)
- (near MOSI) (IB_PWR_RTN)
- INTERFACE BOARD POWER
  (BUCK) IN: 7.2Vnom, OUT: 5V @ 2.7A
- (near CR7) PIC active on power
  switch activation or
  presence of charger power
- PIC MCU LDO REGULATOR
  IN: ___Vnom, OUT: 5V @ 0.1A
- TO/FROM SH. 2
  PIC MCU
- IB POWER
  + COMM
- (near 5V) scope
- SPI MASTER: IB+
  SPI SLAVE:    PB+
- (near 5VTP) pogo
- (near 5VPIC) scope
- (near R29) COMP external network
  optional for extended temp
  operational requirement
- (near 5VOK) power status
  output to PIC
- TITLE:
- Document Number:
- 1700-0003_PowerBoard_REV-A
- REV:
- TransTech Systems, Inc.
- 4/22/2022
- ____-____
- R-
- PQI380+ POWER BOARD SCHEMATIC
- D
- POWER SWITCH
  & STATUS LED
- U5
  ISL85005A
  ISL85005
- POPULATE
  ---
  R31 - FCCM
  (VISHAY CRCW040210K0FKEDC)
- Date:
- 7/10/2024 1:57:37 PM
- Sheet:
- 1

### Library data of the parts
5V 5VPIC 12V BATT+ BATT-(GND) DCIN_S IBPWREN PSWOUT THERM+ THERM- VBAT_SW VBATSWEN VCHRG = TST_POINT_PTH_042-OCT: PART_DESC: PCB feature, test point, ID 42mil, OD 72mil; GateName_1: G$1; SymbolName_1: TST_POINT_PTH_042-OCT; LibraryName: TTECH; DeviceSetName: TST_POINT_PTH_042-OCT
5VIB 5VTP 12VTP LEDBLK LEDRED U1REF U1VL = TST_POINT_PTH_20X40MIL: GateName_1: G$1; SymbolName_1: TST_POINT_PTH_042-OCT; LibraryName: TTECH; DeviceSetName: TST_POINT_PTH_20X40MIL
5VOK = TST_POINT_PTH_20X40MIL_2PIN: PART_DESC: PCB FEATURE, TEST POINT, ID 20MIL, OD 40MIL; GateName_1: G$1; SymbolName_1: TST_POINT_PTH_042-OCT-2PIN; LibraryName: TTECH; DeviceSetName: TST_POINT_PTH_20X40MIL_2PIN
5VON 12VON PICPWR = LED_0603: MANUFACTURER: DIALIGHT; MANUFACTURER_PART_NUMBER: 598-8081-107F; PART_DESC: LED GREEN CLEAR 0603 SMD; GateName_1: A; SymbolName_1: LED; LibraryName: TTECH; DeviceSetName: LED_0603; COPYRIGHT: Copyright (C) 2022 Ultra Librarian. All rights reserved.
!SPI_SS! MISO MOSI SPI_CLK = TST_POINT_PTH_042_2PIN: PART_DESC: PCB feature, test point, ID 42mil, OD 72mil; GateName_1: A; SymbolName_1: TST_POINT_PTH_042-OCT-2PIN; LibraryName: TTECH; DeviceSetName: TST_POINT_PTH_042_2PIN
C1 = CAP_CER_0603_TDK: MANUFACTURER: SAMSUNG; MANUFACTURER_PART_NUMBER: CL10C221JB8NNNC; PART_DESC: CAP CER 220PF 50V C0G/NP0 0603; GateName_1: A; SymbolName_1: CAPH; LibraryName: TTECH; DeviceSetName: CAP_CER_0603_TDK
C2 C4 = CAP_CER_0603_TDK: MANUFACTURER: MURATA; MANUFACTURER_PART_NUMBER: GRM188Z71C475KE21D; PART_DESC: CAP CER 4.7UF 16V X7R 0603; GateName_1: A; SymbolName_1: CAPH; LibraryName: TTECH; DeviceSetName: CAP_CER_0603_TDK
C3 C5 = CAP_CER_1206_SAMSUNG: MANUFACTURER_PART_NUMBER: CL31A226KAHNNNE; PART_DESC: CAP CER 22UF 25V X5R 1206; GateName_1: A; SymbolName_1: CAPH; LibraryName: TTECH; DeviceSetName: CAP_CER_1206_SAMSUNG; COPYRIGHT: Copyright (C) 2022 Ultra Librarian. All rights reserved.; MANUFACTURER: SAMSUNG
C6 = CAP_SMT_EL_CORNELL-DUB_AFK106M25B12T-FCAP_AFK106M25B12T-F_CND-L: MANUFACTURER: Cornell Dubilier; PART_DESC: CAP ALUM 10UF 20% 25V SMD; GateName_1: G$1; SymbolName_1: CAPH+; DeviceName: CAP_AFK106M25B12T-F_CND-L; LibraryName: TTECH; DeviceSetName: CAP_SMT_EL_CORNELL-DUB_AFK106M25B12T-F; +: +; COPYRIGHT: Copyright (C) 2023 Ultra Librarian. All rights reserved.; MANUFACTURER_PART_NUMBER: AFK106M25B12T-F
C7 C14 = CAP_CER_0603_TDK: MANUFACTURER: SAMSUNG; MANUFACTURER_PART_NUMBER: CL10B104KB8NNNC; PART_DESC: CAP CER 0.1UF 50V X7R 0603; GateName_1: A; SymbolName_1: CAPH; LibraryName: TTECH; DeviceSetName: CAP_CER_0603_TDK
C8 C11 C15 C16 C18 C19 C32 C39 = CAP_CER_0402_MURATA: MANUFACTURER: MURATA; MANUFACTURER_PART_NUMBER: GCM155R71C104KA55D; PART_DESC: CAP CER 0.1UF 16V X7R 0402; GateName_1: A; SymbolName_1: CAPH; LibraryName: TTECH; DeviceSetName: CAP_CER_0402_MURATA
C9 = CAP_CER_0402_MURATA: MANUFACTURER: MURATA; MANUFACTURER_PART_NUMBER: C0402C473K3REC7867; PART_DESC: CAP CER 0402 47NF 25V X7R 10%; GateName_1: A; SymbolName_1: CAPH; LibraryName: TTECH; DeviceSetName: CAP_CER_0402_MURATA
C12 = CAP_CER_0402_MURATA: MANUFACTURER: MURATA; MANUFACTURER_PART_NUMBER: C0402C223K5REC7411; PART_DESC: CAP CER 0402 22NF 50V X7R 10%; GateName_1: A; SymbolName_1: CAPH; LibraryName: TTECH; DeviceSetName: CAP_CER_0402_MURATA
C13 = CAP_CER_0603_TDK: MANUFACTURER: SAMSUNG; MANUFACTURER_PART_NUMBER: CL10B105KA8NNNC; PART_DESC: CAP CER 1UF 25V X7R 0603; GateName_1: A; SymbolName_1: CAPH; LibraryName: TTECH; DeviceSetName: CAP_CER_0603_TDK
C17 = CAP_TANT_KEMET_2917: MANUFACTURER: KEMET; MANUFACTURER_PART_NUMBER: T495D226K035ATE300; PART_DESC: CAP TANT 22UF 10% 35V 2917; GateName_1: A; SymbolName_1: PCAPH; LibraryName: TTECH; DeviceSetName: CAP_TANT_KEMET_2917; COPYRIGHT: Copyright (C) 2022 Ultra Librarian. All rights reserved.
C20 = CAP_TANTALUM_KEMET_T495D: MANUFACTURER: KEMET; MANUFACTURER_PART_NUMBER: T495D476K025ATE250; PART_DESC: CAP TANT 47UF 10% 25V 2917; GateName_1: A; SymbolName_1: PCAPH; LibraryName: TTECH; DeviceSetName: CAP_TANTALUM_KEMET_T495D; COPYRIGHT: Copyright (C) 2022 Ultra Librarian. All rights reserved.
C21 = CAP_CER_1206_SAMSUNG: MANUFACTURER_PART_NUMBER: CL31B106KBHNNNE; PART_DESC: CAP CER 10UF 50V X7R 1206; GateName_1: A; SymbolName_1: CAPH; QTY_AREA: (__X); LibraryName: TTECH; DeviceSetName: CAP_CER_1206_SAMSUNG; COPYRIGHT: Copyright (C) 2022 Ultra Librarian. All rights reserved.; MANUFACTURER: SAMSUNG
C22 = CAP_CER_0402_MURATA: MANUFACTURER: MURATA; MANUFACTURER_PART_NUMBER: GRM155R71E223KA61D; PART_DESC: Multilayer Ceramic Capacitors MLCC - SMD/SMT .022UF 25V 10% 0402; GateName_1: A; SymbolName_1: CAPH; LibraryName: TTECH; DeviceSetName: CAP_CER_0402_MURATA
C23 = CAP_CER_1206_SAMSUNG: MANUFACTURER_PART_NUMBER: GCM31CC81E226KE11L; PART_DESC: CAP CER 22UF 25V X6S 1206; GateName_1: A; SymbolName_1: CAPH; LibraryName: TTECH; DeviceSetName: CAP_CER_1206_SAMSUNG; COPYRIGHT: Copyright (C) 2022 Ultra Librarian. All rights reserved.; MANUFACTURER: SAMSUNG
C24 C25 = CAP_CER_1206_SAMSUNG: MANUFACTURER_PART_NUMBER: GCM31CC81E226KE11L; PART_DESC: CAP CER 22UF 25V X6S 1206; GateName_1: A; SymbolName_1: CAPH; QTY_AREA: (3X); LibraryName: TTECH; DeviceSetName: CAP_CER_1206_SAMSUNG; COPYRIGHT: Copyright (C) 2022 Ultra Librarian. All rights reserved.; MANUFACTURER: SAMSUNG
C27 = CAP_CER_0402_MURATA: MANUFACTURER: MURATA; PART_DESC: --- DO NOT POPULATE ---; GateName_1: A; SymbolName_1: CAPH; LibraryName: TTECH; DeviceSetName: CAP_CER_0402_MURATA; MANUFACTURER_PART_NUMBER: MANUFACTURER_PART_NUMBER
C28 = CAP_CER_0402_MURATA: MANUFACTURER: MURATA; MANUFACTURER_PART_NUMBER: GRM155R61E105KA12D; PART_DESC: CAP CER 1UF 25V X5R 0402; GateName_1: A; SymbolName_1: CAPH; LibraryName: TTECH; DeviceSetName: CAP_CER_0402_MURATA
C29 = CAP_CER_0402_MURATA: MANUFACTURER: MURATA; MANUFACTURER_PART_NUMBER: C0402C120K5RAC7867; PART_DESC: CAP CER 12PF 50V X7R 0402; GateName_1: A; SymbolName_1: CAPH; LibraryName: TTECH; DeviceSetName: CAP_CER_0402_MURATA
C30 = CAP_CER_TDK_CKG57: MANUFACTURER: TDK; MANUFACTURER_PART_NUMBER: CKG57NX7R1H476M500JH; PART_DESC: 47 µF ±20% 50V Ceramic Capacitor X7R Stacked SMD, 2 J-Lead; GateName_1: A; SymbolName_1: CAPH; QTY_AREA: (2X); LibraryName: TTECH; DeviceSetName: CAP_CER_TDK_CKG57; COPYRIGHT: Copyright (C) 2022 Ultra Librarian. All rights reserved.
C31 = CAP_CER_TDK_CKG57: MANUFACTURER: TDK; MANUFACTURER_PART_NUMBER: CKG57NX7R1H476M500JH; PART_DESC: 47 µF ±20% 50V Ceramic Capacitor X7R Stacked SMD, 2 J-Lead; GateName_1: A; SymbolName_1: CAPH; LibraryName: TTECH; DeviceSetName: CAP_CER_TDK_CKG57; COPYRIGHT: Copyright (C) 2022 Ultra Librarian. All rights reserved.
C33 = CAP_CER_1206_SAMSUNG: MANUFACTURER_PART_NUMBER: CL31A226KAHNNNE; PART_DESC: CAP CER 22UF 25V X5R 1206; GateName_1: A; SymbolName_1: CAPH; QTY_AREA: (2X); LibraryName: TTECH; DeviceSetName: CAP_CER_1206_SAMSUNG; COPYRIGHT: Copyright (C) 2022 Ultra Librarian. All rights reserved.; MANUFACTURER: SAMSUNG
C36 = CAP_CER_0402_MURATA: MANUFACTURER: MURATA; MANUFACTURER_PART_NUMBER: GRM155C81C225ME15D; PART_DESC: CAP CER 2.2UF 16V X6S 0402; GateName_1: A; SymbolName_1: CAPH; LibraryName: TTECH; DeviceSetName: CAP_CER_0402_MURATA
C43 = CAP_CER_0603_TDK: MANUFACTURER: MURATA; MANUFACTURER_PART_NUMBER: GRM188D71A106KA73D; PART_DESC: CAP CER 10UF 10V X7T 0603; GateName_1: A; SymbolName_1: CAPH; LibraryName: TTECH; DeviceSetName: CAP_CER_0603_TDK
CR1 CR4 = DIODE_SMA: MANUFACTURER: DIODES INC.; MANUFACTURER_PART_NUMBER: ES1A-13-F; PART_DESC: DIODE GEN PURP 50V 1A SMA; GateName_1: A; SymbolName_1: DIODE; LibraryName: TTECH; DeviceSetName: DIODE_SMA; COPYRIGHT: Copyright (C) 2022 Ultra Librarian. All rights reserved.
CR2 = DIODE_SCHOTTKY_SMC: MANUFACTURER: DIODES INC.; MANUFACTURER_PART_NUMBER: B560CQ-13-F; PART_DESC: DIODE SCHOTTKY 60V 5A SMC; GateName_1: A; SymbolName_1: DIODES; QTY_AREA: (2X); LibraryName: TTECH; DeviceSetName: DIODE_SCHOTTKY_SMC; COPYRIGHT: Copyright (C) 2022 Ultra Librarian. All rights reserved.
CR3 = DIODE_SCHOTTKY_SMC: PART_DESC: DIODE SCHOTTKY 60V 5A SMC; GateName_1: A; SymbolName_1: DIODES; LibraryName: TTECH; DeviceSetName: DIODE_SCHOTTKY_SMC; COPYRIGHT: Copyright (C) 2022 Ultra Librarian. All rights reserved.
CR5 = DIODE_ZENER_VISHAY_BZD27C4V3P-E3-08: MANUFACTURER: VISHAY; PART_DESC: DIODE ZENER 4.3V 800MW DO219AB; GateName_1: A; SymbolName_1: DIODE_ZENER; LibraryName: TTECH; DeviceSetName: DIODE_ZENER_VISHAY_BZD27C4V3P-E3-08; COPYRIGHT: Copyright (C) 2022 Ultra Librarian. All rights reserved.; MANUFACTURER_PART_NUMBER: BZD27C4V3P-E3-08
CR6 CR7 = DIODE_SCHOTTKY_TOSHIBA_1SS404: MANUFACTURER_PART_NUMBER: 1SS404; PART_DESC: DIODE SCHOTTKY 20V 300MA USC; GateName_1: A; SymbolName_1: DIODE_SCHOTTY; LibraryName: TTECH; DeviceSetName: DIODE_SCHOTTKY_TOSHIBA_1SS404; COPYRIGHT: Copyright (C) 2022 Ultra Librarian. All rights reserved.; MANUFACTURER: TOSHIBA
J1 = MOLEX_MINI-FIT-JR_462075004: PART_DESC: MINI-FIT JR LCP VERT. HDR PEGS 4; GateName_1: G$1; SymbolName_1: 462075004; LibraryName: TTECH; DeviceSetName: MOLEX_MINI-FIT-JR_462075004
J2 = MOLEX_NANO-FIT_1053111302: MANUFACTURER: MOLEX; PART_DESC: CONN HEADER VERT 2POS 2.5MM; GateName_1: A; SymbolName_1: CON_1053111302; LibraryName: TTECH; DeviceSetName: MOLEX_NANO-FIT_1053111302; COPYRIGHT: Copyright (C) 2022 Ultra Librarian. All rights reserved.; MANUFACTURER_PART_NUMBER: MANUFACTURER_PART_NUMBER
J3 = MOLEX_NANO-FIT_1053111304: PART_DESC: HEADER, NANOFIT, VERT, 4 POS 2.5mm; GateName_1: G$1; SymbolName_1: CON_1054301304; LibraryName: TTECH; DeviceSetName: MOLEX_NANO-FIT_1053111304; MANUFACTURER: MANUFACTURER; MANUFACTURER_PART_NUMBER: MANUFACTURER_PART_NUMBER
J4 = MOLEX_1053111206: PART_DESC: CONN HEADER VERT 6POS 2.5MM; GateName_1: A; SymbolName_1: CON_1053111206; LibraryName: TTECH; DeviceSetName: MOLEX_1053111206; COPYRIGHT: Copyright (C) 2022 Ultra Librarian. All rights reserved.; MANUFACTURER: MANUFACTURER; MANUFACTURER_PART_NUMBER: MANUFACTURER_PART_NUMBER
J5 = MOLEX_NANO-FIT_1053111303: MANUFACTURER: MOLEX; PART_DESC: CONN HEADER VERT 3POS 2.5MM; GateName_1: A; SymbolName_1: CON_1053111303; LibraryName: TTECH; DeviceSetName: MOLEX_NANO-FIT_1053111303; COPYRIGHT: Copyright (C) 2022 Ultra Librarian. All rights reserved.; MANUFACTURER_PART_NUMBER: MANUFACTURER_PART_NUMBER
J6 = CON_MOLEX_NANOFIT_1053121304: MANUFACTURER: MOLEX; PART_DESC: CONN HEADER VERT 4POS 2.5MM; GateName_1: A; SymbolName_1: CON_1053121304; LibraryName: TTECH; DeviceSetName: CON_MOLEX_NANOFIT_1053121304; 2x2: 2x2; MANUFACTURER_PART_NUMBER: MANUFACTURER_PART_NUMBER
L1 = INDUCTOR_COILCRAFT_XAL5030: MANUFACTURER_PART_NUMBER: XAL5030-122MEC; PART_DESC: Fixed Inductors 1.2uH Shld 20% 11.1A 9.4mOhms AECQ2; GateName_1: A; SymbolName_1: IND; LibraryName: TTECH; DeviceSetName: INDUCTOR_COILCRAFT_XAL5030; COPYRIGHT: Copyright (C) 2022 Ultra Librarian. All rights reserved.; MANUFACTURER: COILCRAFT
L2 = INDUCTOR_PWR_EATON_DR127-220-R: PART_DESC: FIXED IND 22UH 4A 39.1 MOHM SMD; GateName_1: A; SymbolName_1: INDUCTOR1; LibraryName: TTECH; DeviceSetName: INDUCTOR_PWR_EATON_DR127-220-R; COPYRIGHT: Copyright (C) 2022 Ultra Librarian. All rights reserved.
L3 = INDUCTOR_EATON_DRA74: MANUFACTURER: EATON; MANUFACTURER_PART_NUMBER: DRA74-3R3-R; PART_DESC: FIXED IND 3.3UH 4.16A 16MOHM SMD; GateName_1: A; SymbolName_1: IND; LibraryName: TTECH; DeviceSetName: INDUCTOR_EATON_DRA74; COPYRIGHT: Copyright (C) 2022 Ultra Librarian. All rights reserved.
Q1 Q2 = MOSFET_N-CH_DIODES-INC_DMS3015SSS-13: ENHANCEMENT MODE MOSFET; PART_DESC: N-Channel 30 V 11A (Ta) 1.55W (Ta) Surface Mount 8-SO; GateName_1: A; SymbolName_1: MOSFET_N-CH; LibraryName: TTECH; DeviceSetName: MOSFET_N-CH_DIODES-INC_DMS3015SSS-13
Q3 Q5 Q8 = MOSFET_P-CH_ALPHA&OMEGA_AO4485: Transistor: P-MOSFET; unipolar; -40V; -8A; 1.1W; SO8; PART_DESC: MOSFET P-CH 40V 10A 8SOIC; GateName_1: G$1; SymbolName_1: AO4485; LibraryName: TTECH; DeviceSetName: MOSFET_P-CH_ALPHA&OMEGA_AO4485; 4: 4
Q4 = TRANS_PNP_SOT-23-3_DIOTEC: PART_DESC: Bipolar Transistors - BJT Bipolar Transistor, SOT-23, 45V, 800mA, PNP; GateName_1: A; SymbolName_1: TRANS_PNP; LibraryName: TTECH; DeviceSetName: TRANS_PNP_SOT-23-3_DIOTEC
Q6 = MOSFET_P-CH_VISHAY_SI7145DP-T1-GE3: MANUFACTURER: VISHAY; PART_DESC: MOSFET P-CH 30V 60A PPAK SO-8; GateName_1: A; SymbolName_1: TRANS_N-MOSFET8V2_01; LibraryName: TTECH; DeviceSetName: MOSFET_P-CH_VISHAY_SI7145DP-T1-GE3; 4: 4
Q7 Q9-Q11 = MMBT2222ATT3G: MANUFACTURER: ONSEMI; PART_DESC: TRANS NPN 40V 0.6A SC75 SOT416; GateName_1: A; SymbolName_1: MMBT2222ATT3G; LibraryName: TTECH; DeviceSetName: MMBT2222ATT3G; MANUFACTURER_PART_NUMBER: MMBT2222ATT3G
R4 R8-R10 R21 R25 R27 R29 R35-R37 R58 R59 R61 R62 = RES_0402_VISHAY: RES SMD ... 0402; MANUFACTURER: VISHAY; PART_DESC: RES 10K OHM 1% 1/16W 0402; GateName_1: G$1; SymbolName_1: CRCW040210K0FKEDC; LibraryName: TTECH; DeviceSetName: RES_0402_VISHAY; MANUFACTURER_PART_NUMBER: CRCW040210K0FKEDC
R5 = RES_0402_VISHAY: RES SMD ... 0402; MANUFACTURER: STACKPOLE; MANUFACTURER_PART_NUMBER: RMCF0402FT133K; PART_DESC: RES 133K OHM 1% 1/16W 0402; GateName_1: G$1; SymbolName_1: CRCW040210K0FKEDC; LibraryName: TTECH; DeviceSetName: RES_0402_VISHAY
R6 = RES_0402_VISHAY: RES SMD ... 0402; MANUFACTURER: TECONN; MANUFACTURER_PART_NUMBER: CPF0402B86K6E1; PART_DESC: RES SMD 86.6KOHM 0.1% 1/16W 0402; GateName_1: G$1; SymbolName_1: CRCW040210K0FKEDC; LibraryName: TTECH; DeviceSetName: RES_0402_VISHAY
R11 = RES_0402_VISHAY: RES SMD ... 0402; MANUFACTURER: VISHAY; MANUFACTURER_PART_NUMBER: CRCW0402174KFKTD; PART_DESC: Thick Film Resistors - SMD 1/16watt 174Kohms 1%; GateName_1: G$1; SymbolName_1: CRCW040210K0FKEDC; LibraryName: TTECH; DeviceSetName: RES_0402_VISHAY
R12 = RES_0402_VISHAY: RES SMD ... 0402; MANUFACTURER: YAGEO; MANUFACTURER_PART_NUMBER: RC0402FR-07178KL; PART_DESC: RES 178K OHM 1% 1/16W 0402; GateName_1: G$1; SymbolName_1: CRCW040210K0FKEDC; LibraryName: TTECH; DeviceSetName: RES_0402_VISHAY
R13 = RES_0402_VISHAY: RES SMD ... 0402; MANUFACTURER: VISHAY; MANUFACTURER_PART_NUMBER: CRCW0402732KFKED; PART_DESC: Thick Film Resistors - SMD 1/16watt 732Kohms 1%; GateName_1: G$1; SymbolName_1: CRCW040210K0FKEDC; LibraryName: TTECH; DeviceSetName: RES_0402_VISHAY
R16 R20 = RES_0402_VISHAY: RES SMD ... 0402; MANUFACTURER: VISHAY; MANUFACTURER_PART_NUMBER: CRCW040210R0FKEDC; PART_DESC: RES 10 OHM 1% 1/16W 0402; GateName_1: G$1; SymbolName_1: CRCW040210K0FKEDC; LibraryName: TTECH; DeviceSetName: RES_0402_VISHAY
R17 R18 = RES_2512_TECONN: MANUFACTURER: TECONN; MANUFACTURER_PART_NUMBER: TLRP3A20CR090FTE; PART_DESC: RES 0.09 OHM 1% 2W 2512; GateName_1: A; SymbolName_1: RES; QTY_AREA: (2X); LibraryName: TTECH; DeviceSetName: RES_2512_TECONN
R19 R54 R57 = RES_0805_STACKPOLE: MANUFACTURER_PART_NUMBER: HCJ0805ZT0R00; PART_DESC: RES 0 OHM JUMPER 1/2W 0805; GateName_1: A; SymbolName_1: RES; LibraryName: TTECH; DeviceSetName: RES_0805_STACKPOLE; COPYRIGHT: Copyright (C) 2022 Ultra Librarian. All rights reserved.; MANUFACTURER: STACKPOLE
R22 = RES_0402_VISHAY: RES SMD ... 0402; MANUFACTURER: VISHAY; MANUFACTURER_PART_NUMBER: CRCW040280K6FKED; PART_DESC: RES SMD 80.6K OHM 1% 1/16W 0402; GateName_1: G$1; SymbolName_1: CRCW040210K0FKEDC; LibraryName: TTECH; DeviceSetName: RES_0402_VISHAY
R23 = RES_0402_VISHAY: RES SMD ... 0402; MANUFACTURER: VISHAY; MANUFACTURER_PART_NUMBER: MCS0402MD4993BE000; PART_DESC: MCS 0402-25 0.1% AT E0 499K; GateName_1: G$1; SymbolName_1: CRCW040210K0FKEDC; LibraryName: TTECH; DeviceSetName: RES_0402_VISHAY
R24 = RES_0402_VISHAY: RES SMD ... 0402; MANUFACTURER: VISHAY; MANUFACTURER_PART_NUMBER: TNPW040295K3BEED; PART_DESC: RES 95.3K OHM 0.1% 1/16W 0402; GateName_1: G$1; SymbolName_1: CRCW040210K0FKEDC; LibraryName: TTECH; DeviceSetName: RES_0402_VISHAY
R26 R56 = RES_0603_STACKPOLE: MANUFACTURER_PART_NUMBER: RMCF0603FT1K15; PART_DESC: RES 1.15K OHM 1% 1/10W 0603; GateName_1: A; SymbolName_1: RES; LibraryName: TTECH; DeviceSetName: RES_0603_STACKPOLE; COPYRIGHT: Copyright (C) 2022 Ultra Librarian. All rights reserved.; MANUFACTURER: STACKPOLE
R28 R38 R60 R63 = RES_0402_VISHAY: RES SMD ... 0402; MANUFACTURER: VISHAY; MANUFACTURER_PART_NUMBER: CRCW04021K00FKEDC; PART_DESC: RES 1K OHM 1% 1/16W 0402; GateName_1: G$1; SymbolName_1: CRCW040210K0FKEDC; LibraryName: TTECH; DeviceSetName: RES_0402_VISHAY
R30 = RES_0603_STACKPOLE: MANUFACTURER_PART_NUMBER: RNCS0603BKE10K0; PART_DESC: RES 10K OHM 0.1% 1/16W 0603; GateName_1: A; SymbolName_1: RES; LibraryName: TTECH; DeviceSetName: RES_0603_STACKPOLE; COPYRIGHT: Copyright (C) 2022 Ultra Librarian. All rights reserved.; MANUFACTURER: STACKPOLE
R31 = RES_0402_VISHAY: RES SMD ... 0402; MANUFACTURER: ---; PART_DESC: DNP - RES 0402; GateName_1: G$1; SymbolName_1: CRCW040210K0FKEDC; LibraryName: TTECH; DeviceSetName: RES_0402_VISHAY; MANUFACTURER_PART_NUMBER: ---
R55 = RES_1206_YAGEO: MANUFACTURER: VISHAY; MANUFACTURER_PART_NUMBER: CRCW12064K64FKEAC; PART_DESC: RES 4.64K OHM 1% 1/4W 1206; GateName_1: A; SymbolName_1: RES; LibraryName: TTECH; DeviceSetName: RES_1206_YAGEO; COPYRIGHT: Copyright (C) 2022 Ultra Librarian. All rights reserved.
U1 = MAX1647EAP+: PART_DESC: IC BATT CHG MULTI-CHEM 20SSOP; GateName_1: A; SymbolName_1: MAX1647EAP+; LibraryName: TTECH; DeviceSetName: MAX1647EAP+; MANUFACTURER_PART_NUMBER: MAX1647EAP+
U3 = AD_REFERENCE_ADR364AUJZ-REEL7: PART_DESC: Series Voltage Reference IC Fixed 4.096V V ±0.2% 5 mA TSOT-23-5; GateName_1: A; SymbolName_1: ADR364AUJZ-REEL7; LibraryName: TTECH; DeviceSetName: AD_REFERENCE_ADR364AUJZ-REEL7
U4 = REGULATOR_BOOST_TI_TPS61178RNWT: PART_DESC: IC REG BOOST ADJ 10A 13VQFN; GateName_1: A; SymbolName_1: TPS611781RNW; LibraryName: TTECH; DeviceSetName: REGULATOR_BOOST_TI_TPS61178RNWT; COPYRIGHT: Copyright (C) 2022 Ultra Librarian. All rights reserved.
U5 = REGULATOR_BUCK_RENESAS_ISL85005AFRZ-T7A: RENESAS - ISL85005AFRZ-T7A - DC/DC CONV, SYNC BUCK, DFN-12   Source:  Datasheet   Check availability; PART_DESC: Buck Switching Regulator IC Positive Adjustable 5V 1 Output 5A 12-VFDFN Exposed Pad; GateName_1: G$1; SymbolName_1: ISL85005AFRZ-T7A; LibraryName: TTECH; DeviceSetName: REGULATOR_BUCK_RENESAS_ISL85005AFRZ-T7A
U6 = IC_LDO_STM_LD2981CM50TR: PART_DESC: Linear Voltage Regulator IC Positive Fixed 1 Output 100mA SOT-23-5; GateName_1: A; SymbolName_1: LD2981CM50TR; LibraryName: TTECH; DeviceSetName: IC_LDO_STM_LD2981CM50TR; COPYRIGHT: Copyright (C) 2022 Ultra Librarian. All rights reserved.
U7 = IC_H-BRIDGE_TI_DRV8220DRLR: PART_DESC: 20-V, 1-A H-BRIDGE MOTOR DRIVER; GateName_1: A; SymbolName_1: DRV8220DRL; LibraryName: TTECH; DeviceSetName: IC_H-BRIDGE_TI_DRV8220DRLR

## Sheet 1700-0003_PowerBoard_REV-A_1.SchDoc: 1700-0003_PowerBoard_REV-A
size 885 x 589 mm; DRAWING_DATE: 4/15/2022; DRAWING_TITLE: PQI380 UNIV. INTERFACE BRD; PART_NUMBER: 7000-0303; REV: R12; Origin: Eagle; DWG-CO-NAME: TransTech Systems, Inc.; DWG-DATE: 11-2022; DWG-NUMBER: ____-____; DWG-REV: R-; DWG-TITLE: PQI380+ POWER BOARD SCHEMATIC (v2); SIZE: D; Date: 7/10/2024 1:57:37 PM; SheetNumber: 2; GateName_1: G$1; SymbolName_1: FRAME_D_L; LibraryName: frames; DeviceSetName: FRAME_D_L; GateName_2: G$2; SymbolName_2: DOCFIELD; Sheet: Sheet:
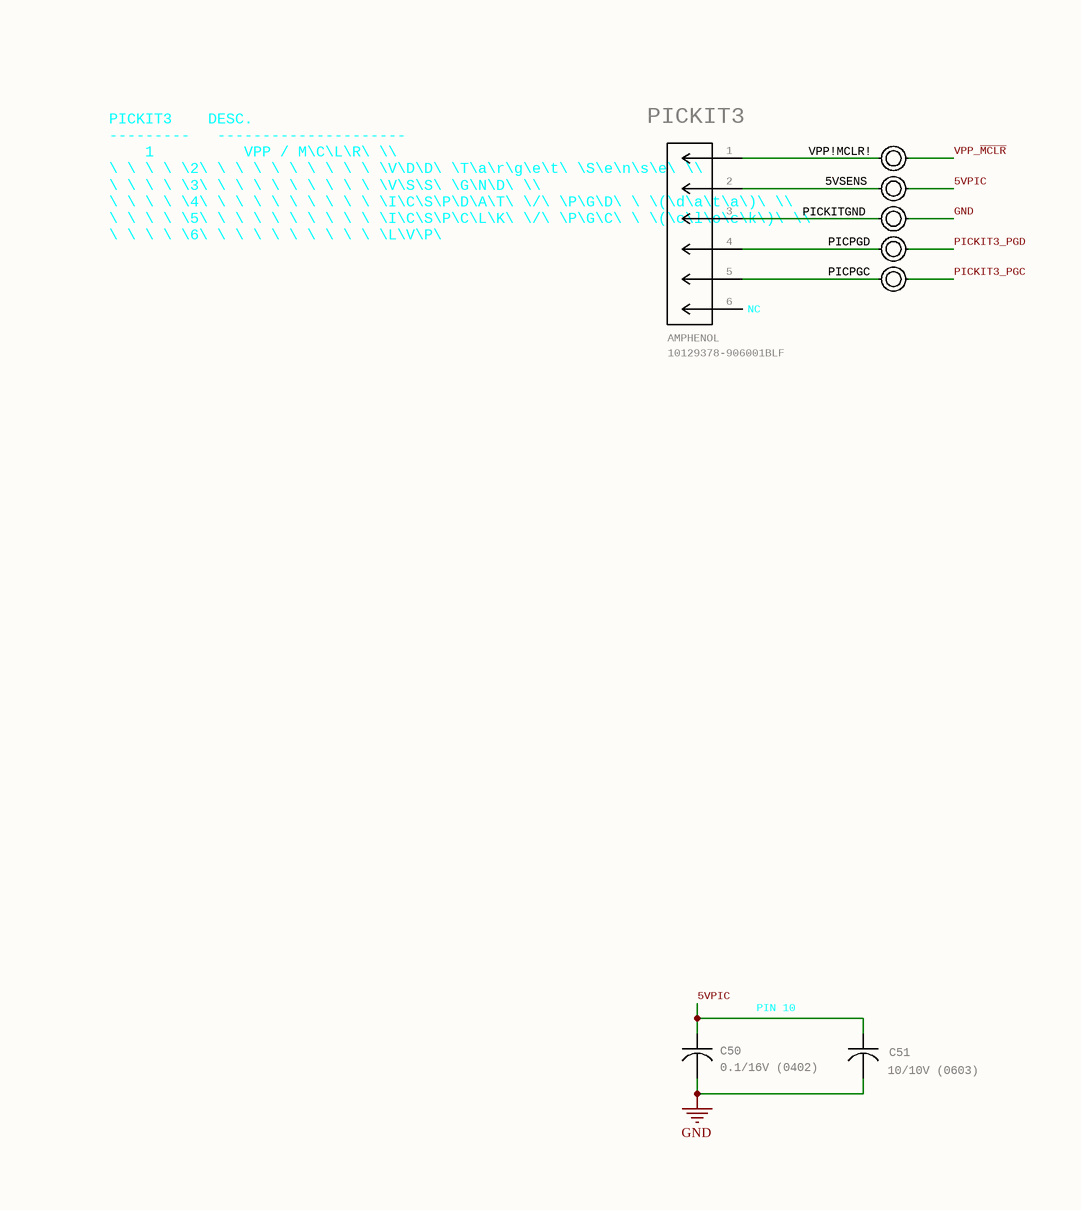
[diagram p6: 1700-0003_PowerBoard_REV-A_1.SchDoc, top left]
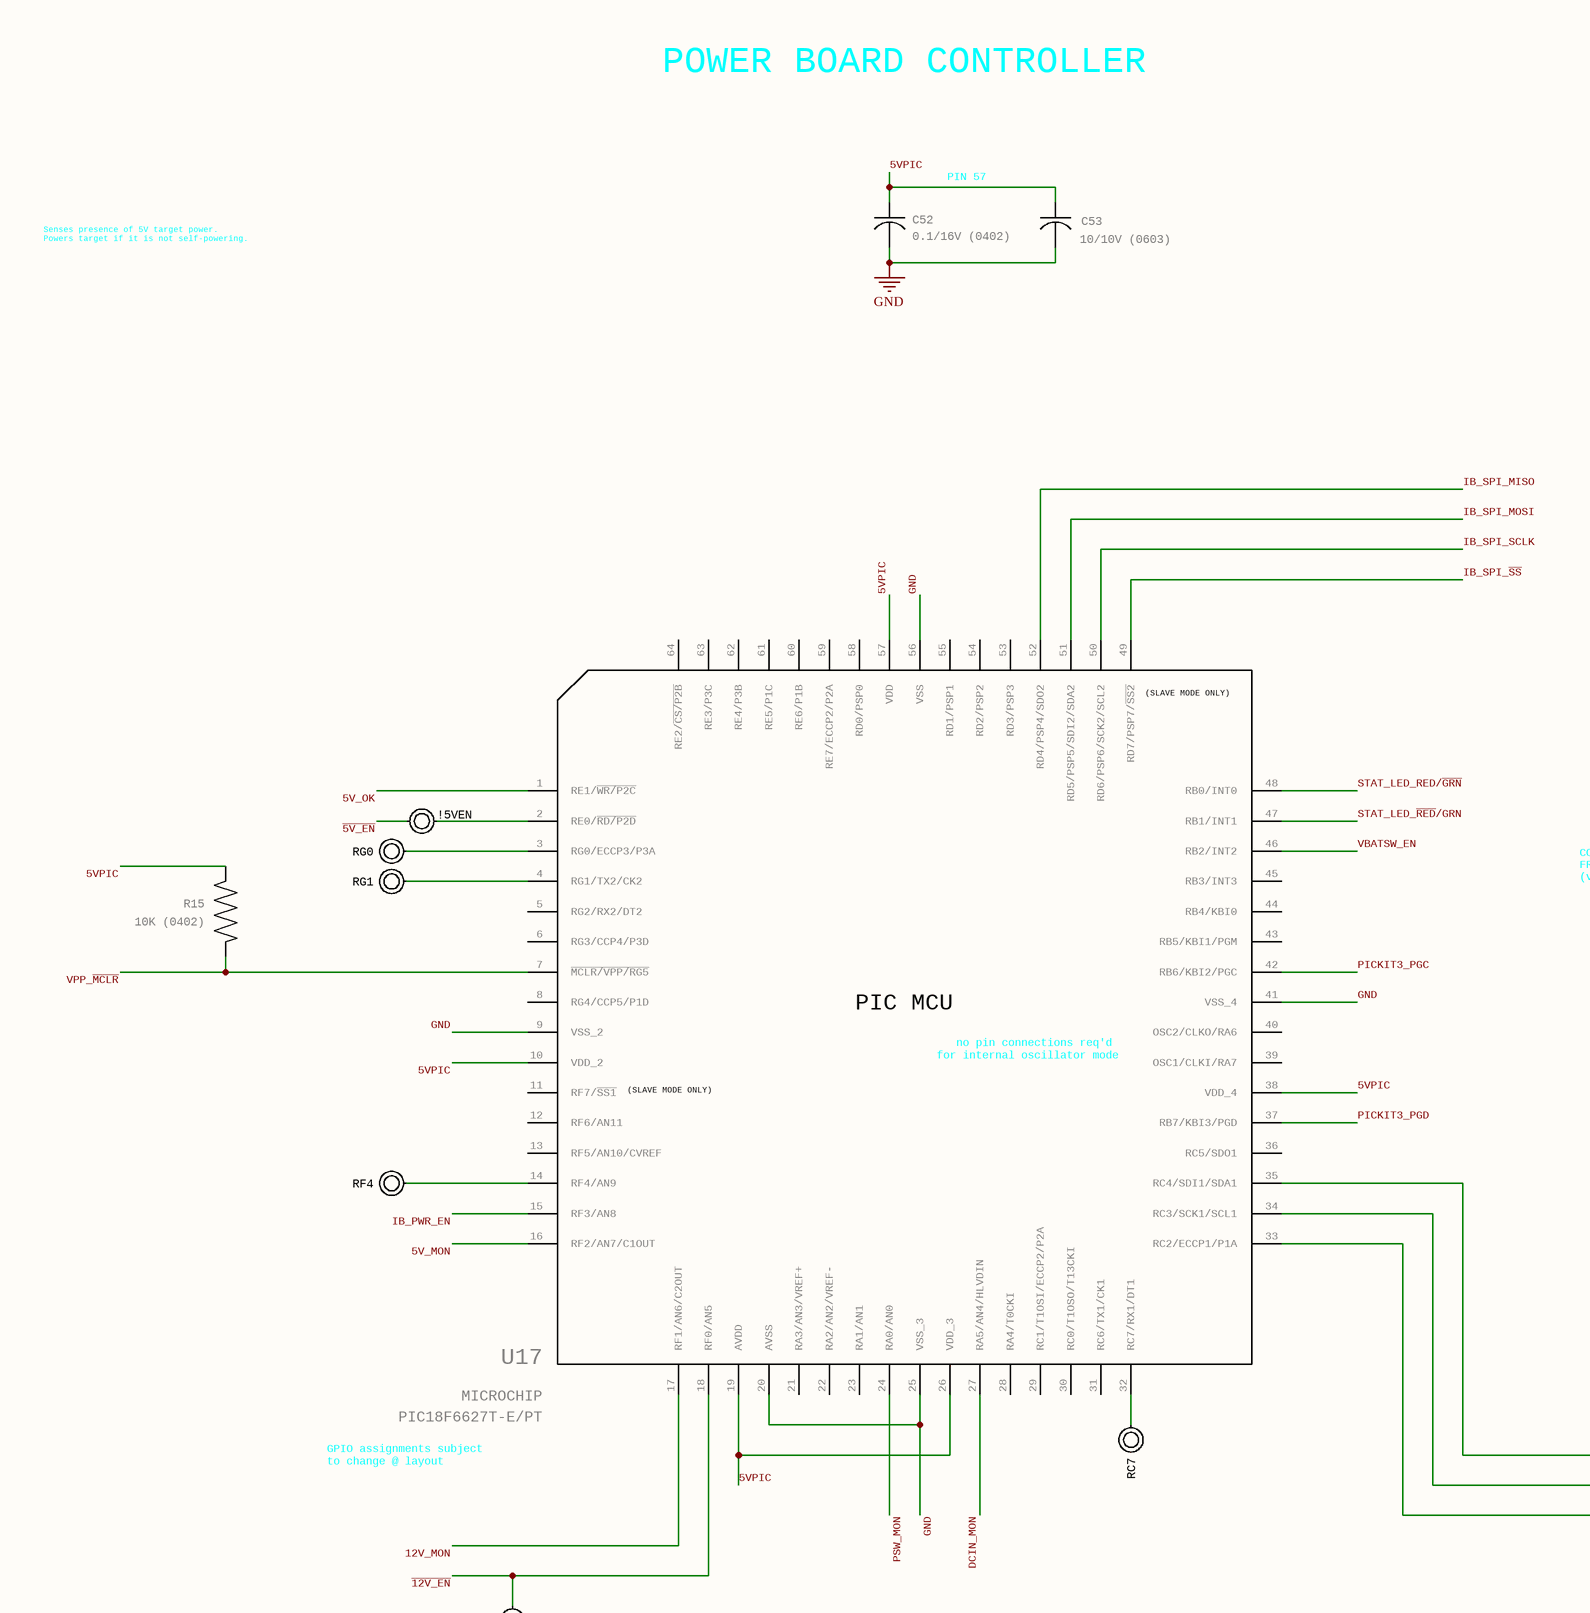
[diagram p7: 1700-0003_PowerBoard_REV-A_1.SchDoc, top middle]
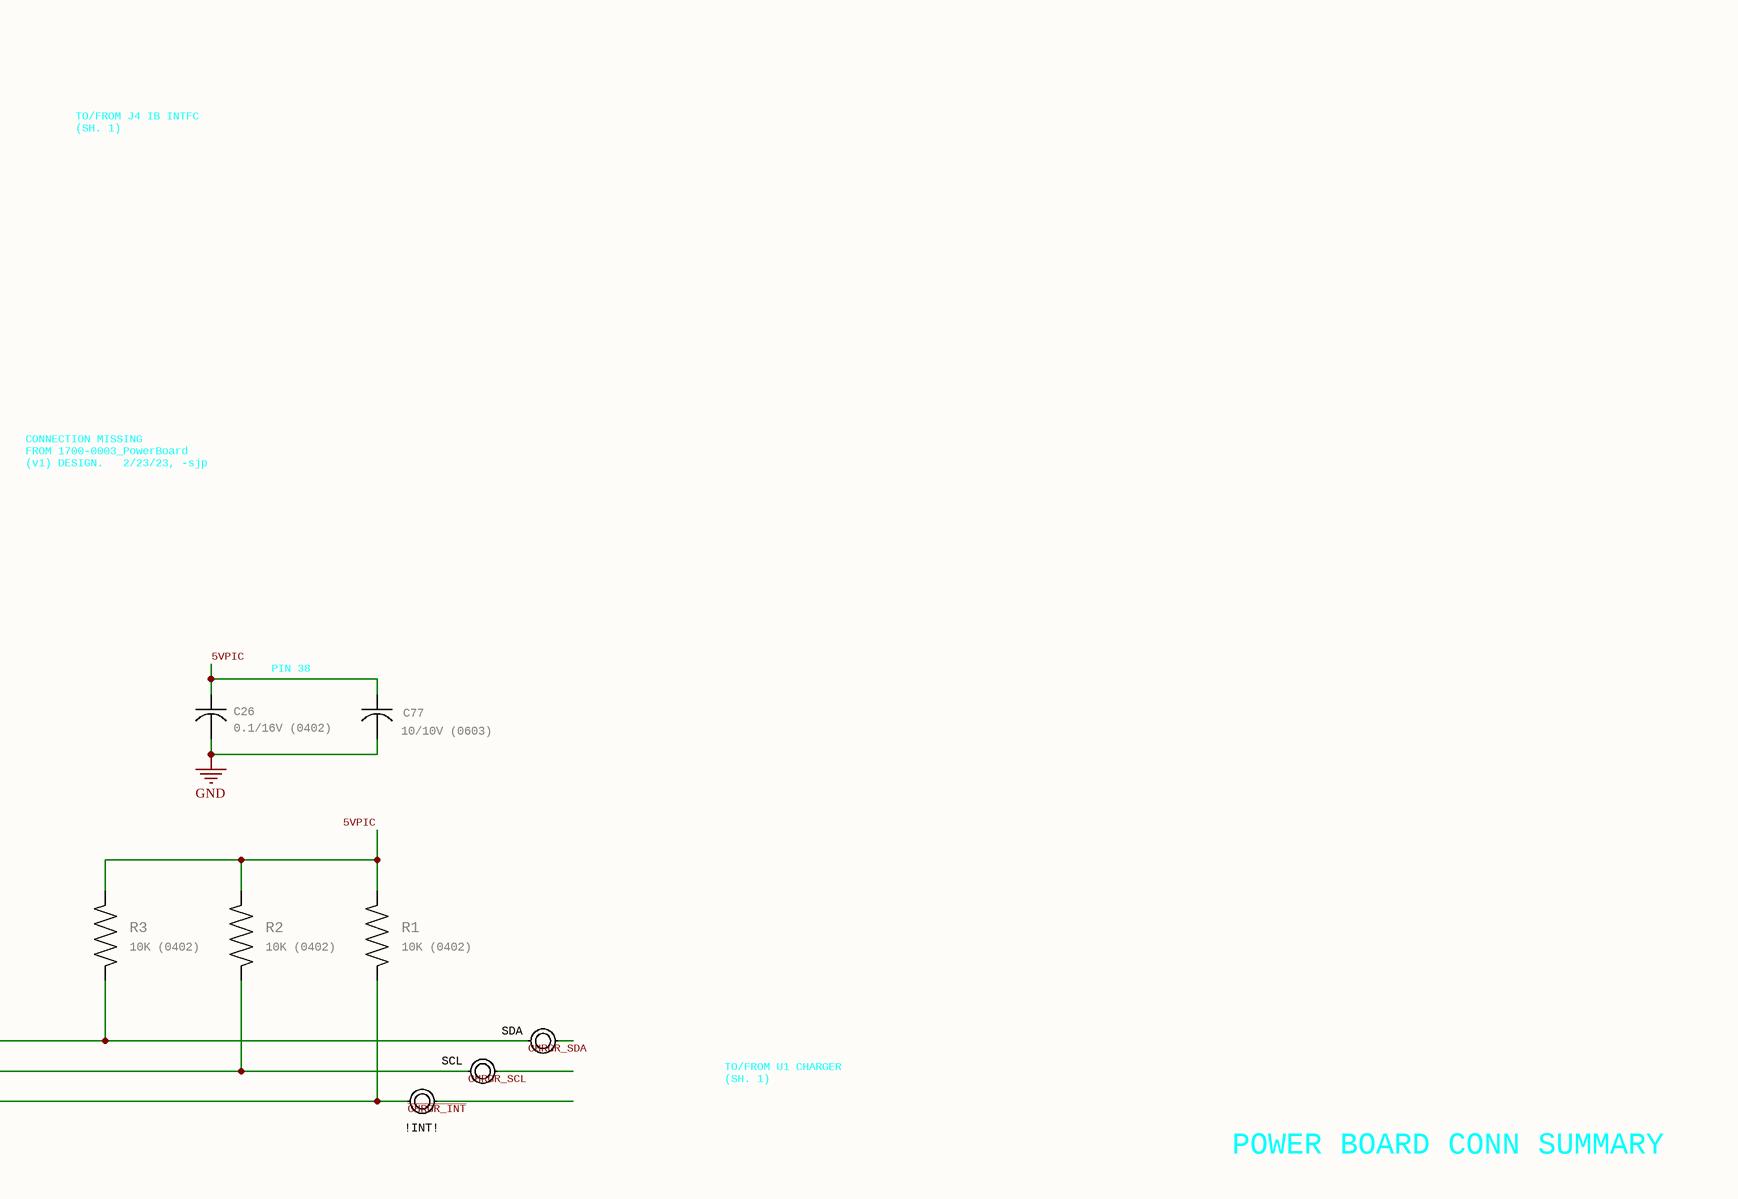
[diagram p8: 1700-0003_PowerBoard_REV-A_1.SchDoc, top right]
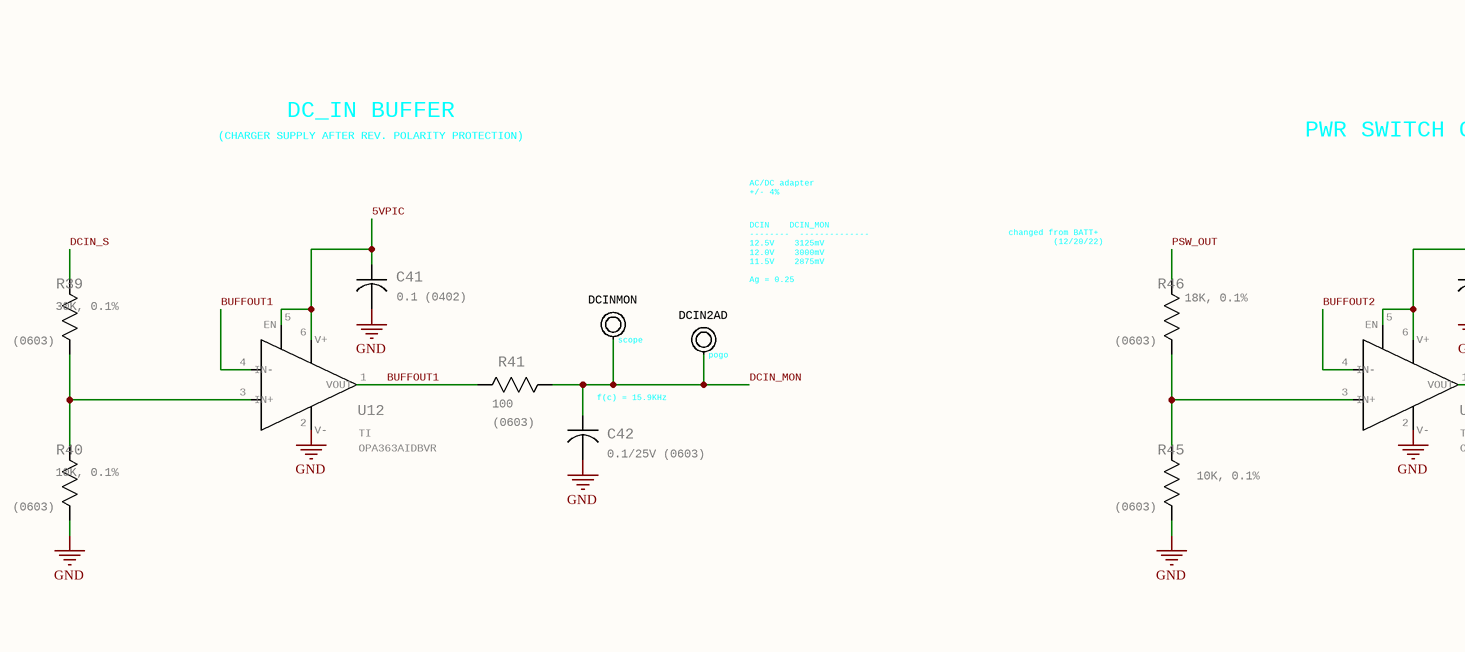
[diagram p9: 1700-0003_PowerBoard_REV-A_1.SchDoc, bottom left]
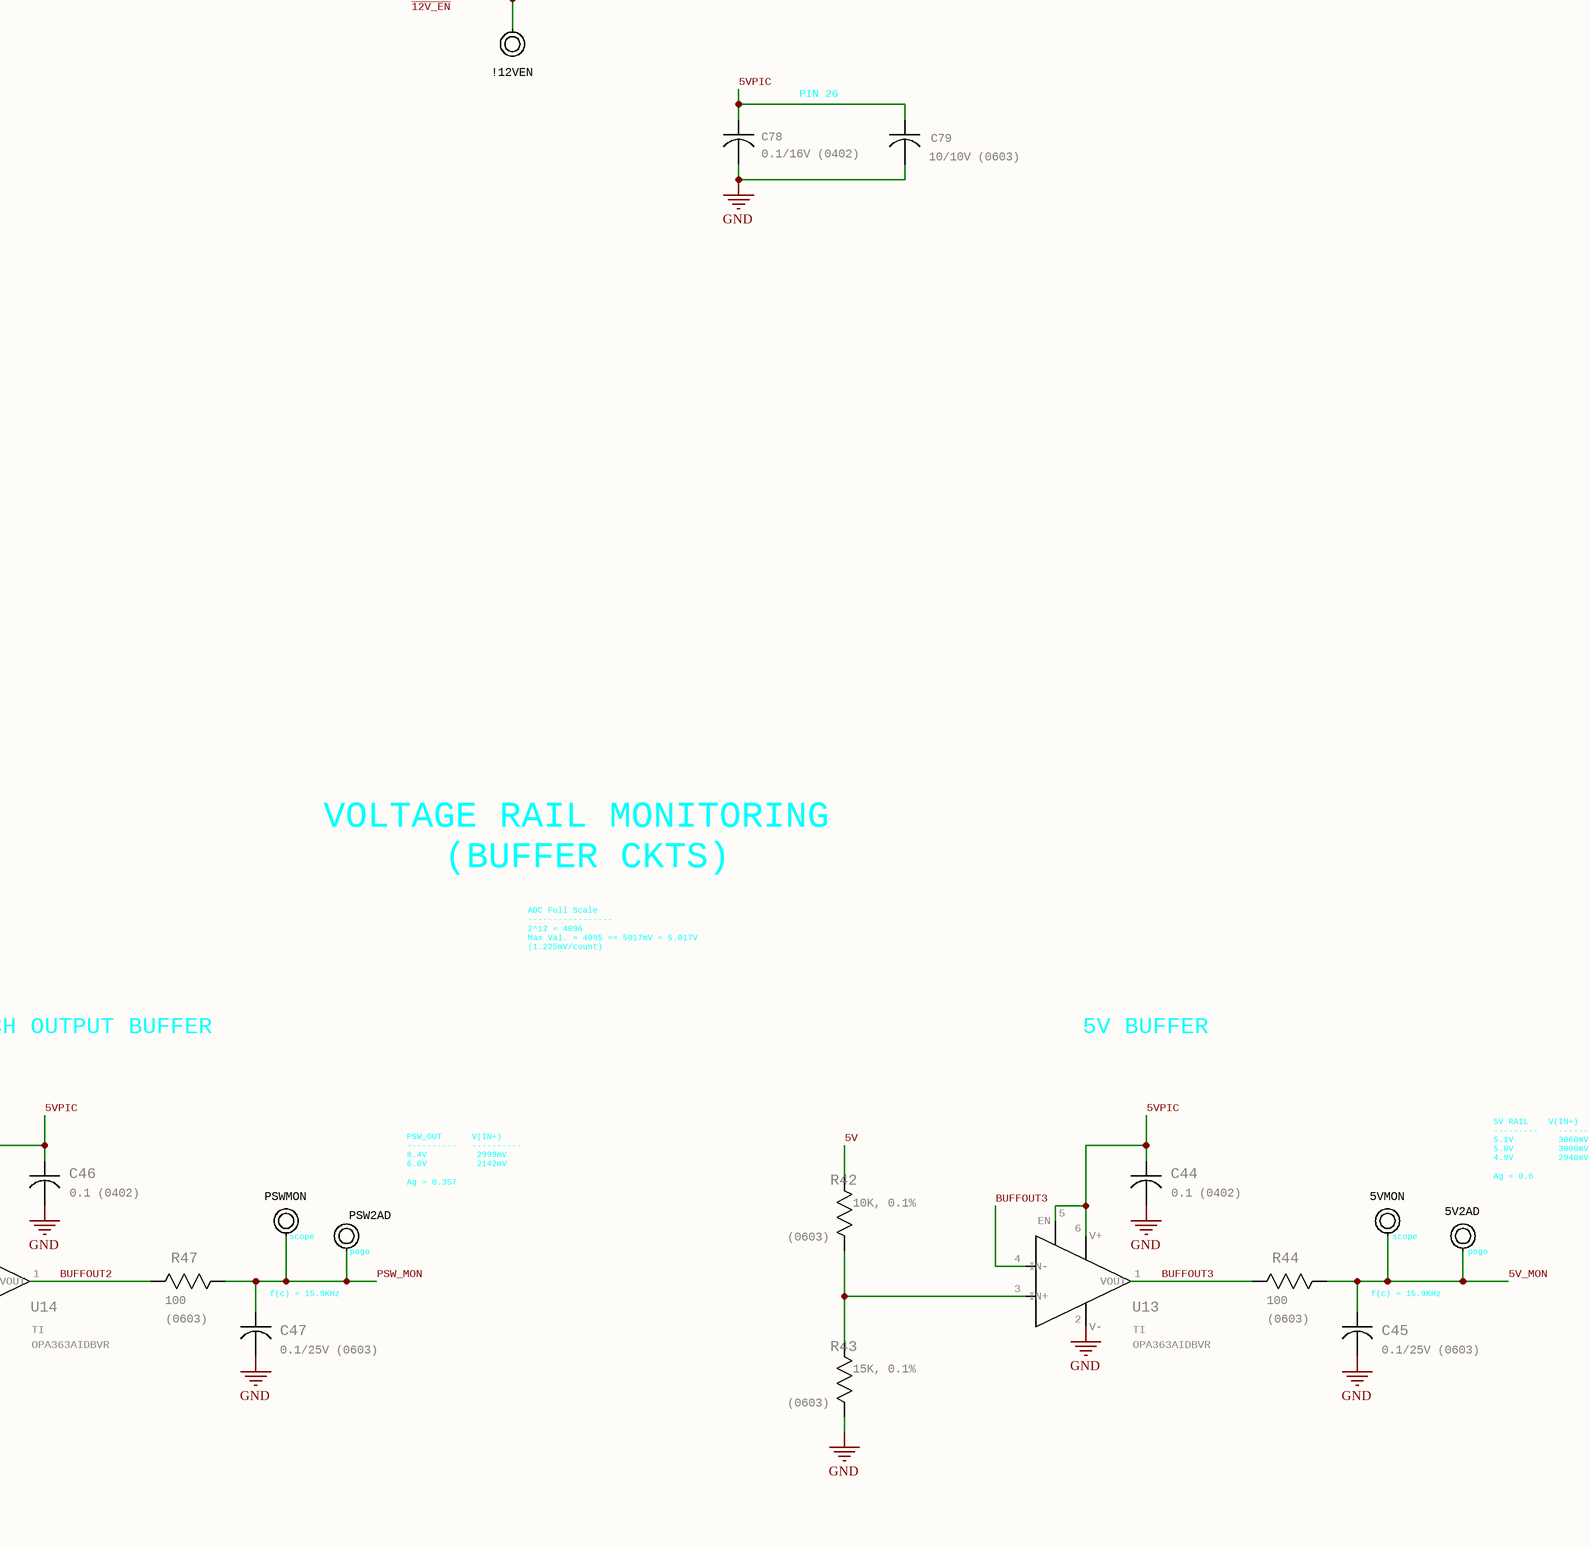
[diagram p10: 1700-0003_PowerBoard_REV-A_1.SchDoc, bottom middle]
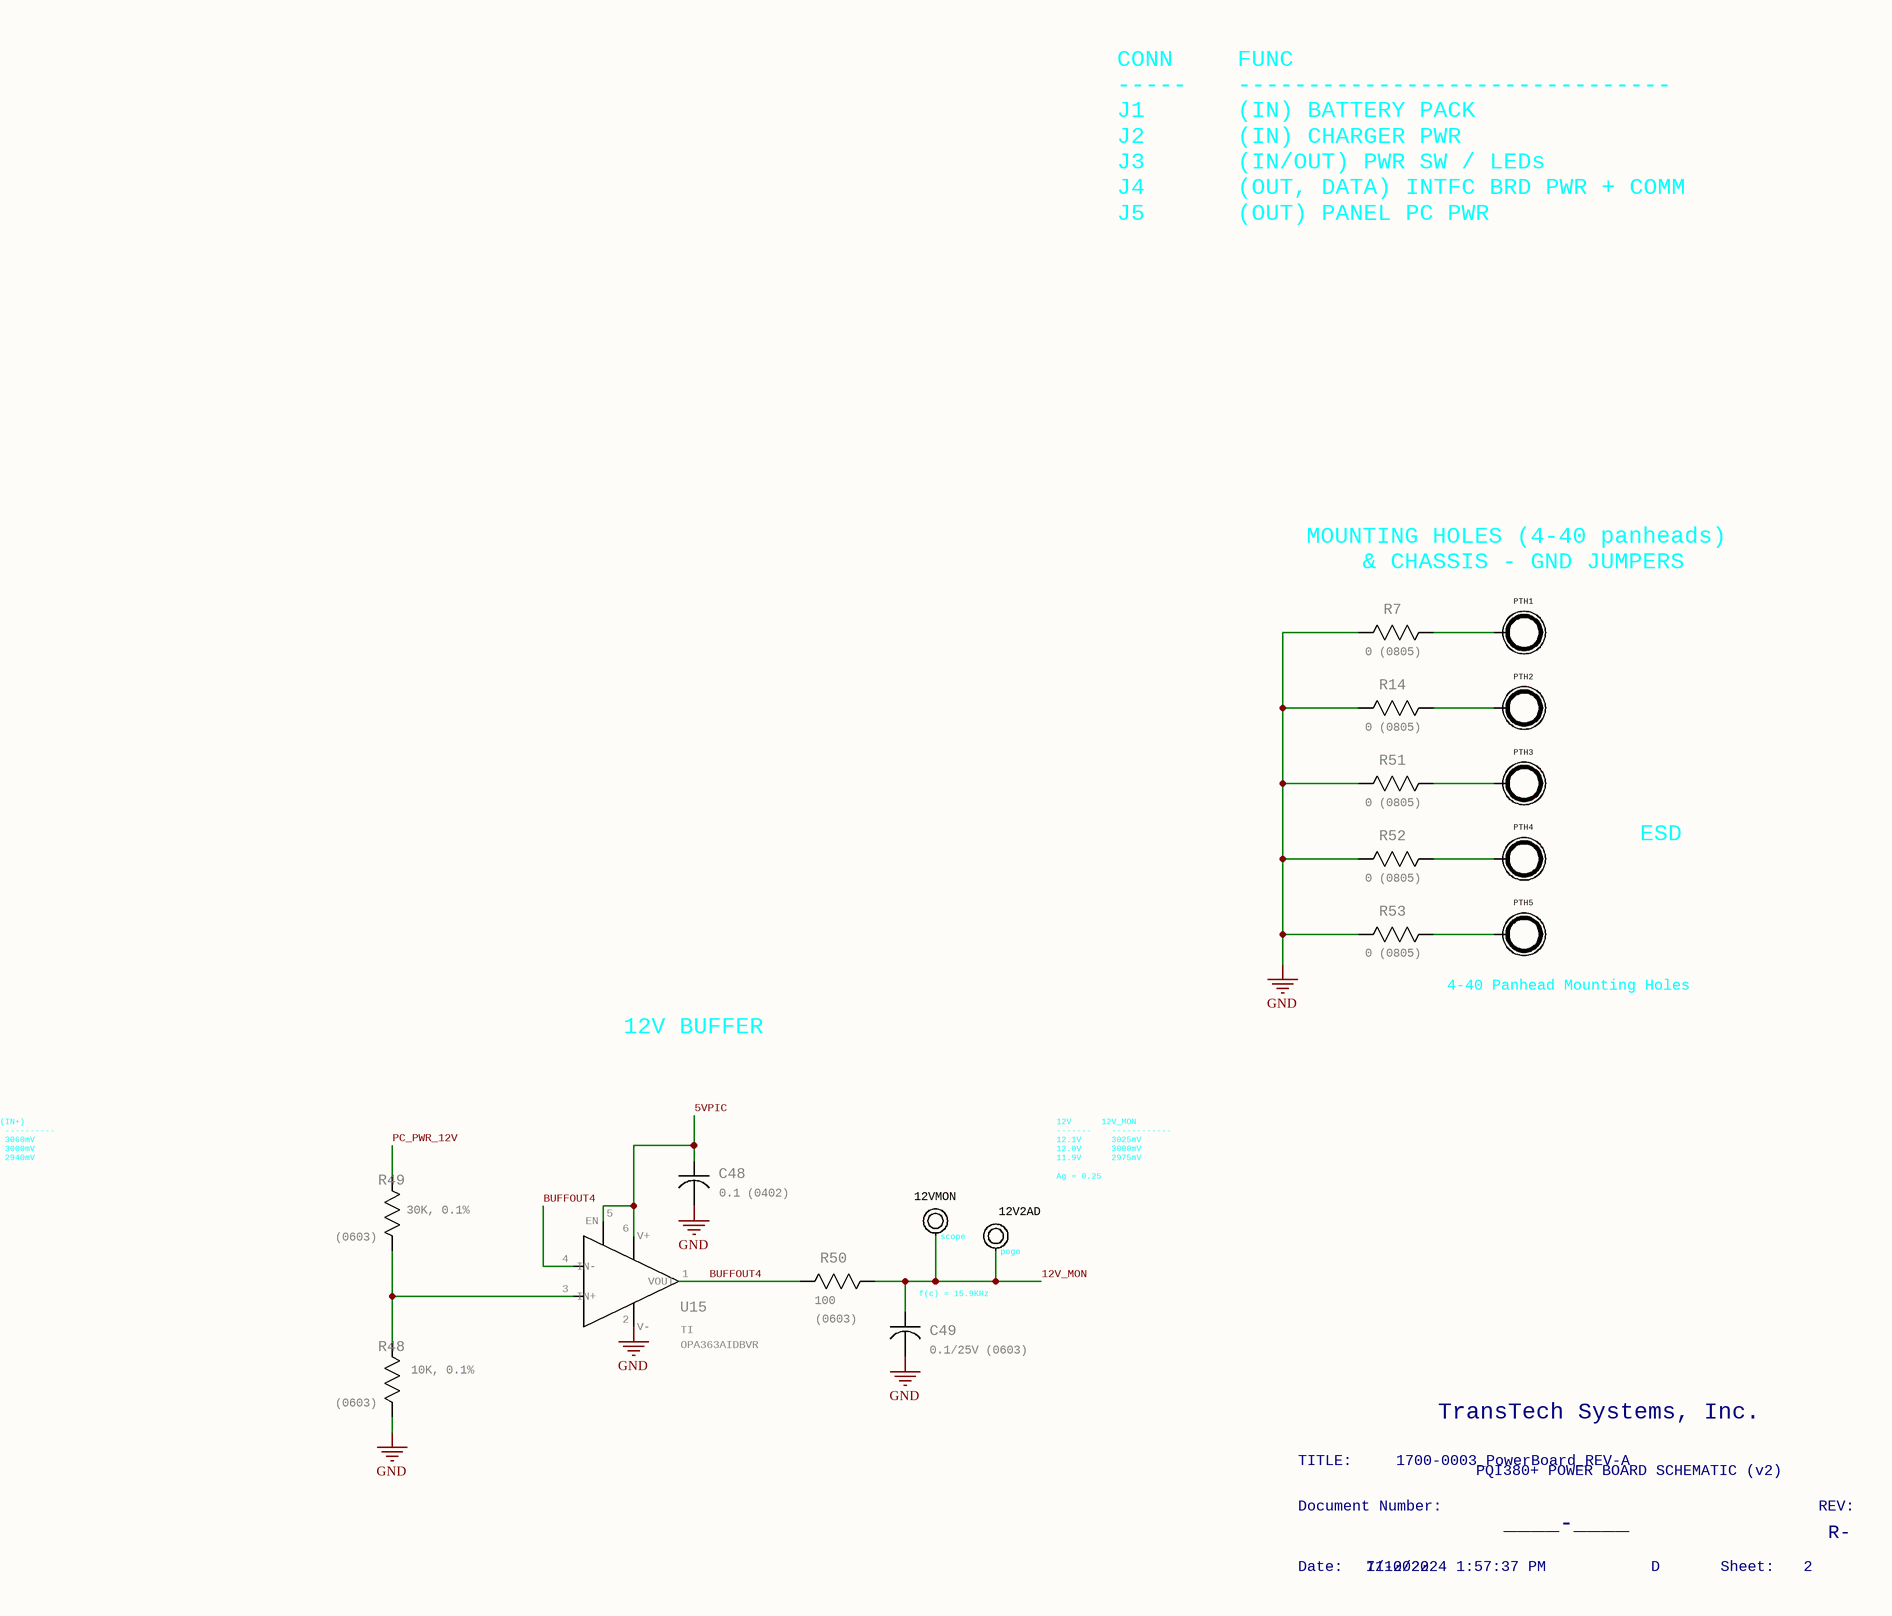
[diagram p11: 1700-0003_PowerBoard_REV-A_1.SchDoc, bottom right]

### Parts
5V2AD  TST_POINT_PTH_20X40MIL  [TST_POINT_PTH_20X40MIL]  (value not drawn)
5VMON  TST_POINT_PTH_042-OCT  [TST_POINT_PTH_042-OCT]  (value not drawn)
5VSENS  TST_POINT_PTH_20X40MIL_2PIN  [TST_POINT_PTH_20X40MIL_2PIN]  (value not drawn)
12V2AD  TST_POINT_PTH_20X40MIL  [TST_POINT_PTH_20X40MIL]  (value not drawn)
12VMON  TST_POINT_PTH_042-OCT  [TST_POINT_PTH_042-OCT]  (value not drawn)
!5VEN  TST_POINT_PTH_20X40MIL_2PIN  [TST_POINT_PTH_20X40MIL_2PIN]  (value not drawn)
!12VEN  TST_POINT_PTH_20X40MIL  [TST_POINT_PTH_20X40MIL]  (value not drawn)
!INT!  TST_POINT_PTH_20X40MIL_2PIN  [TST_POINT_PTH_20X40MIL_2PIN]  (value not drawn)
C26  0.1/16V (0402)  [G-155_MUR]
C41  0.1 (0402)  [G-155_MUR]
C42  0.1/25V (0603)  [CAP_C1608_TDK]
C44  0.1 (0402)  [G-155_MUR]
C45  0.1/25V (0603)  [CAP_C1608_TDK]
C46  0.1 (0402)  [G-155_MUR]
C47  0.1/25V (0603)  [CAP_C1608_TDK]
C48  0.1 (0402)  [G-155_MUR]
C49  0.1/25V (0603)  [CAP_C1608_TDK]
C50  0.1/16V (0402)  [G-155_MUR]
C51  10/10V (0603)  [CAP_C1608_TDK]
C52  0.1/16V (0402)  [G-155_MUR]
C53  10/10V (0603)  [CAP_C1608_TDK]
C77  10/10V (0603)  [CAP_C1608_TDK]
C78  0.1/16V (0402)  [G-155_MUR]
C79  10/10V (0603)  [CAP_C1608_TDK]
DCIN2AD  TST_POINT_PTH_20X40MIL  [TST_POINT_PTH_20X40MIL]  (value not drawn)
DCINMON  TST_POINT_PTH_042-OCT  [TST_POINT_PTH_042-OCT]  (value not drawn)
PICKIT3  MANUFACTURER: AMPHENOL  MANUFACTURER_PART_NUMBER: 10129378-906001BLF  [CON6_1X6_VERT-HDR]  (hidden comment: CON_6POS_VERT-HDR_AMPH_10129378-906001)
PICKITGND  TST_POINT_PTH_20X40MIL_2PIN  [TST_POINT_PTH_20X40MIL_2PIN]  (value not drawn)
PICPGC  TST_POINT_PTH_20X40MIL_2PIN  [TST_POINT_PTH_20X40MIL_2PIN]  (value not drawn)
PICPGD  TST_POINT_PTH_20X40MIL_2PIN  [TST_POINT_PTH_20X40MIL_2PIN]  (value not drawn)
PSW2AD  TST_POINT_PTH_20X40MIL  [TST_POINT_PTH_20X40MIL]  (value not drawn)
PSWMON  TST_POINT_PTH_042-OCT  [TST_POINT_PTH_042-OCT]  (value not drawn)
PTH1  PTH_4-40  [PTH_4-40]  (value not drawn)
PTH2  PTH_4-40  [PTH_4-40]  (value not drawn)
PTH3  PTH_4-40  [PTH_4-40]  (value not drawn)
PTH4  PTH_4-40  [PTH_4-40]  (value not drawn)
PTH5  PTH_4-40  [PTH_4-40]  (value not drawn)
R1  10K (0402)  [RESC1005X35N]
R2  10K (0402)  [RESC1005X35N]
R3  10K (0402)  [RESC1005X35N]
R7  0 (0805)  [STA_HCJ0805_STP]
R14  0 (0805)  [STA_HCJ0805_STP]
R15  10K (0402)  [RESC1005X35N]
R39  30K, 0.1%  PACKAGE: (0603)  [STA_RMCF0603_STP]
R40  10K, 0.1%  PACKAGE: (0603)  [STA_RMCF0603_STP]
R41  100  PACKAGE: (0603)  [STA_RMCF0603_STP]
R42  10K, 0.1%  PACKAGE: (0603)  [STA_RMCF0603_STP]
R43  15K, 0.1%  PACKAGE: (0603)  [STA_RMCF0603_STP]
R44  100  PACKAGE: (0603)  [STA_RMCF0603_STP]
R45  10K, 0.1%  PACKAGE: (0603)  [STA_RMCF0603_STP]
R46  18K, 0.1%  PACKAGE: (0603)  [STA_RMCF0603_STP]
R47  100  PACKAGE: (0603)  [STA_RMCF0603_STP]
R48  10K, 0.1%  PACKAGE: (0603)  [STA_RMCF0603_STP]
R49  30K, 0.1%  PACKAGE: (0603)  [STA_RMCF0603_STP]
R50  100  PACKAGE: (0603)  [STA_RMCF0603_STP]
R51  0 (0805)  [STA_HCJ0805_STP]
R52  0 (0805)  [STA_HCJ0805_STP]
R53  0 (0805)  [STA_HCJ0805_STP]
RC7  TST_POINT_PTH_042-OCT  [TST_POINT_PTH_042-OCT]  (value not drawn)
RF4  TST_POINT_PTH_042-OCT  [TST_POINT_PTH_042-OCT]  (value not drawn)
RG0  TST_POINT_PTH_042-OCT  [TST_POINT_PTH_042-OCT]  (value not drawn)
RG1  TST_POINT_PTH_042-OCT  [TST_POINT_PTH_042-OCT]  (value not drawn)
SCL  TST_POINT_PTH_20X40MIL_2PIN  [TST_POINT_PTH_20X40MIL_2PIN]  (value not drawn)
SDA  TST_POINT_PTH_20X40MIL_2PIN  [TST_POINT_PTH_20X40MIL_2PIN]  (value not drawn)
U12  MANUFACTURER: TI  MANUFACTURER_PART_NUMBER: OPA363AIDBVR  [DBV6]  (hidden comment: IC_OPAMP_TI_OPA363AIDBVR)
U13  MANUFACTURER: TI  MANUFACTURER_PART_NUMBER: OPA363AIDBVR  [DBV6]  (hidden comment: IC_OPAMP_TI_OPA363AIDBVR)
U14  MANUFACTURER: TI  MANUFACTURER_PART_NUMBER: OPA363AIDBVR  [DBV6]  (hidden comment: IC_OPAMP_TI_OPA363AIDBVR)
U15  MANUFACTURER: TI  MANUFACTURER_PART_NUMBER: OPA363AIDBVR  [DBV6]  (hidden comment: IC_OPAMP_TI_OPA363AIDBVR)
U17  PICMCU: PIC MCU  (SLAVEMODEONLY): (SLAVE MODE ONLY)  MANUFACTURER: MICROCHIP  [TQFP64_10X10MC_MCH]  (hidden comment: PIC18F6627T-E/PT)
VPP!MCLR!  TST_POINT_PTH_20X40MIL_2PIN  [TST_POINT_PTH_20X40MIL_2PIN]  (value not drawn)

### Nets
GND: C26.2 C41.2 C42.2 C44.2 C45.2 C46.2 C47.2 C48.2 C49.2 C50.2 C51.2 C52.2 C53.2 C77.2 C78.2 C79.2 PICKITGND.P$1 R7.2 R14.2 R40.2 R43.2 R45.2 R48.2 R51.2 R52.2 R53.2 U12.2(V-) U13.2(V-) U14.2(V-) U15.2(V-) U17.9(VSS_2) U17.20(AVSS) U17.25(VSS_3) U17.41(VSS_4) U17.56(VSS)
~{12V_EN}: !12VEN.P$1 U17.18(RF0/AN5)
~{5V_EN}: !5VEN.P$2
5V: R42.1
5V_MON: 5V2AD.P$1 5VMON.P$1 C45.1 R44.2 U17.16(RF2/AN7/C1OUT)
5V_OK: U17.1(RE1/~{WR/P2C})
5VPIC: 5VSENS.P$1 C26.1 C41.1 C44.1 C46.1 C48.1 C50.1 C51.1 C52.1 C53.1 C77.1 C78.1 C79.1 R1.1 R2.1 R3.1 R15.1 U12.5(EN) U12.6(V+) U13.5(EN) U13.6(V+) U14.5(EN) U14.6(V+) U15.5(EN) U15.6(V+) U17.10(VDD_2) U17.19(AVDD) U17.26(VDD_3) U17.38(VDD_4) U17.57(VDD)
12V_MON: 12V2AD.P$1 12VMON.P$1 C49.1 R50.2 U17.17(RF1/AN6/C2OUT)
BUFFOUT1: R41.1 U12.1(VOUT) U12.4(IN-)
BUFFOUT2: R47.1 U14.1(VOUT) U14.4(IN-)
BUFFOUT3: R44.1 U13.1(VOUT) U13.4(IN-)
BUFFOUT4: R50.1 U15.1(VOUT) U15.4(IN-)
~{CHRGR_INT}: !INT!.P$2 R1.2 U17.33(RC2/ECCP1/P1A)
CHRGR_SCL: R2.2 SCL.P$2 U17.34(RC3/SCK1/SCL1)
CHRGR_SDA: R3.2 SDA.P$2 U17.35(RC4/SDI1/SDA1)
DCIN_MON: C42.1 DCIN2AD.P$1 DCINMON.P$1 R41.2 U17.27(RA5/AN4/HLVDIN)
DCIN_S: R39.1
IB_PWR_EN: U17.15(RF3/AN8)
IB_SPI_MISO: U17.52(RD4/PSP4/SDO2)
IB_SPI_MOSI: U17.51(RD5/PSP5/SDI2/SDA2)
IB_SPI_~{SS}: U17.49(RD7/PSP7/~{SS2})
IB_SPI_SCLK: U17.50(RD6/PSP6/SCK2/SCL2)
PC_PWR_12V: R49.1
PICKIT3_PGC: PICPGC.P$1 U17.42(RB6/KBI2/PGC)
PICKIT3_PGD: PICPGD.P$1 U17.37(RB7/KBI3/PGD)
PSW_MON: C47.1 PSW2AD.P$1 PSWMON.P$1 R47.2 U17.24(RA0/AN0)
PSW_OUT: R46.1
STAT_LED_~{RED}/GRN: U17.47(RB1/INT1)
STAT_LED_RED/~{GRN}: U17.48(RB0/INT0)
VBATSW_EN: U17.46(RB2/INT2)
VPP_~{MCLR}: R15.2 U17.7(~{MCLR/VPP/RG5}) VPP!MCLR!.P$1
Net5VSENS_P$2: 5VSENS.P$2 PICKIT3.2
Net!5VEN_P$1: !5VEN.P$1 U17.2(RE0/~{RD/P2D})
NetPICKIT3_1: PICKIT3.1 VPP!MCLR!.P$2
NetPICKIT3_3: PICKIT3.3 PICKITGND.P$2
NetPICKIT3_4: PICKIT3.4 PICPGD.P$2
NetPICKIT3_5: PICKIT3.5 PICPGC.P$2
NetPTH1_P$1: PTH1.P$1 R7.1
NetPTH2_P$1: PTH2.P$1 R14.1
NetPTH3_P$1: PTH3.P$1 R51.1
NetPTH4_P$1: PTH4.P$1 R52.1
NetPTH5_P$1: PTH5.P$1 R53.1
NetR39_2: R39.2 R40.1 U12.3(IN+)
NetR42_2: R42.2 R43.1 U13.3(IN+)
NetR45_1: R45.1 R46.2 U14.3(IN+)
NetR48_1: R48.1 R49.2 U15.3(IN+)
NetRC7_P$1: RC7.P$1 U17.32(RC7/RX1/DT1)
NetRF4_P$1: RF4.P$1 U17.14(RF4/AN9)
NetRG0_P$1: RG0.P$1 U17.3(RG0/ECCP3/P3A)
NetRG1_P$1: RG1.P$1 U17.4(RG1/TX2/CK2)

Not connected (* = marked no-connect by the designer): !INT! P$1; PICKIT3 6; SCL P$1; SDA P$1; U17 5(RG2/RX2/DT2) 6(RG3/CCP4/P3D) 8(RG4/CCP5/P1D) 11(RF7/~{SS1}) 12(RF6/AN11) 13(RF5/AN10/CVREF) 21(RA3/AN3/VREF+) 22(RA2/AN2/VREF-) 23(RA1/AN1) 28(RA4/T0CKI) 29(RC1/T1OSI/ECCP2/P2A) 30(RC0/T1OSO/T13CKI) 31(RC6/TX1/CK1) 36(RC5/SDO1) 39(OSC1/CLKI/RA7) 40(OSC2/CLKO/RA6) 43(RB5/KBI1/PGM) 44(RB4/KBI0) 45(RB3/INT3) 53(RD3/PSP3) 54(RD2/PSP2) 55(RD1/PSP1) 58(RD0/PSP0) 59(RE7/ECCP2/P2A) 60(RE6/P1B) 61(RE5/P1C) 62(RE4/P3B) 63(RE3/P3C) 64(RE2/~{CS/P2B})

### Notes on the sheet
- POWER BOARD CONTROLLER
- PIN 57
- Senses presence of 5V target power.
  Powers target if it is not self-powering.
- PICKIT3    DESC.
  ---------   ---------------------
  1          VPP / M\C\L\R\ \\
  \ \ \ \ \2\ \ \ \ \ \ \ \ \ \ \V\D\D\ \T\a\r\g\e\t\ \S\e\n\s\e\ \\
  \ \ \ \ \3\ \ \ \ \ \ \ \ \ \ \V\S\S\ \G\N\D\ \\
  \ \ \ \ \4\ \ \ \ \ \ \ \ \ \ \I\C\S\P\D\A\T\ \/\ \P\G\D\ \ \(\d\a\t\a\)\ \\
  \ \ \ \ \5\ \ \ \ \ \ \ \ \ \ \I\C\S\P\C\L\K\ \/\ \P\G\C\ \ \(\c\l\o\c\k\)\ \\
  \ \ \ \ \6\ \ \ \ \ \ \ \ \ \ \L\V\P\
- (near PICKIT3) NC
- TO/FROM J4 IB INTFC
  (SH. 1)
- CONNECTION MISSING
  FROM 1700-0003_PowerBoard
  (v1) DESIGN.   2/23/23, -sjp
- PIN 10
- (near U17) no pin connections req'd
  for internal oscillator mode
- PIN 38
- GPIO assignments subject
  to change @ layout
- TO/FROM U1 CHARGER
  (SH. 1)
- POWER BOARD CONN SUMMARY
- PIN 26
- CONN
  -----
  J1
  J2
  J3
  J4
  J5
- FUNC
  -------------------------------
  (IN) BATTERY PACK
  (IN) CHARGER PWR
  (IN/OUT) PWR SW / LEDs
  (OUT, DATA) INTFC BRD PWR + COMM
  (OUT) PANEL PC PWR
- MOUNTING HOLES (4-40 panheads)
  & CHASSIS - GND JUMPERS
- VOLTAGE RAIL MONITORING
  (BUFFER CKTS)
- ESD
- ADC Full Scale
  -----------------
  2^12 = 4096
  Max Val. = 4095 == 5017mV = 5.017V
  (1.225mV/count)
- DC_IN BUFFER
- (CHARGER SUPPLY AFTER REV. POLARITY PROTECTION)
- PWR SWITCH OUTPUT BUFFER
- 5V BUFFER
- 12V BUFFER
- 4-40 Panhead Mounting Holes
- AC/DC adapter
  +/- 4%
- changed from BATT+
  (12/20/22)
- DCIN    DCIN_MON
  --------  --------------
  12.5V    3125mV
  12.0V    3000mV
  11.5V    2875mV
  Ag = 0.25
- PSW_OUT      V(IN+)
  ----------   ----------
  8.4V          2999mV
  6.0V          2142mV
  Ag = 0.357
- 5V RAIL    V(IN+)
  ---------    ----------
  5.1V         3060mV
  5.0V         3000mV
  4.9V         2940mV
  Ag = 0.6
- 12V      12V_MON
  -------    ------------
  12.1V      3025mV
  12.0V      3000mV
  11.9V      2975mV
  Ag = 0.25
- (near DCINMON) scope
- (near DCIN2AD) pogo
- (near PSWMON) scope
- (near PSW2AD) pogo
- (near 5VMON) scope
- (near 5V2AD) pogo
- (near 12VMON) scope
- (near 12V2AD) pogo
- (near C42) f(c) = 15.9KHz
- f(c) = 15.9KHz
- (near C45) f(c) = 15.9KHz
- TransTech Systems, Inc.
- TITLE:
- Document Number:
- 1700-0003_PowerBoard_REV-A
- PQI380+ POWER BOARD SCHEMATIC (v2)
- REV:
- Date:
- 7/10/2024 1:57:37 PM
- 11-2022
- ____-____
- D
- Sheet:
- 2
- R-

### Library data of the parts
5V2AD 12V2AD !12VEN DCIN2AD PSW2AD = TST_POINT_PTH_20X40MIL: as 5VIB on sheet 1700-0003_PowerBoard_REV-A_0; LibraryName: TTECH; DeviceSetName: TST_POINT_PTH_20X40MIL
5VMON 12VMON DCINMON PSWMON RC7 RF4 RG0 RG1 = TST_POINT_PTH_042-OCT: as 5V on sheet 1700-0003_PowerBoard_REV-A_0; SymbolName_1: TST_POINT_PTH_042-OCT; LibraryName: TTECH; DeviceSetName: TST_POINT_PTH_042-OCT
5VSENS !5VEN !INT! PICKITGND PICPGC PICPGD SCL SDA VPP!MCLR! = TST_POINT_PTH_20X40MIL_2PIN: as 5VOK on sheet 1700-0003_PowerBoard_REV-A_0; LibraryName: TTECH; DeviceSetName: TST_POINT_PTH_20X40MIL_2PIN
C26 C41 C44 C46 C48 C50 C52 C78 = CAP_CER_0402_MURATA: as C8 on sheet 1700-0003_PowerBoard_REV-A_0; LibraryName: TTECH; DeviceSetName: CAP_CER_0402_MURATA
C42 C45 C47 C49 = CAP_CER_0603_TDK: MANUFACTURER: KEMET; MANUFACTURER_PART_NUMBER: C0603C104K3RAC7867; PART_DESC: CAP CER 0.1UF 25V X7R 0603; GateName_1: A; SymbolName_1: CAPH; LibraryName: TTECH; DeviceSetName: CAP_CER_0603_TDK
C51 C53 C77 C79 = CAP_CER_0603_TDK: as C43 on sheet 1700-0003_PowerBoard_REV-A_0; LibraryName: TTECH; DeviceSetName: CAP_CER_0603_TDK
PICKIT3 = CON_6POS_VERT-HDR_AMPH_10129378-906001: PART_DESC: Connector Header Through Hole 6 position 0.100" (2.54mm); GateName_1: A; SymbolName_1: CON6_1X6_P100RM_HDR_7; LibraryName: TTECH; DeviceSetName: CON_6POS_VERT-HDR_AMPH_10129378-906001
PTH1-PTH5 = PTH_4-40: PART_DESC: PCB feature, PTH 4-40, ID 148mil, OD 220mil; GateName_1: PTH; SymbolName_1: MNT-HOLE; LibraryName: TTECH; DeviceSetName: PTH_4-40
R1-R3 R15 = RES_0402_VISHAY: as R4 on sheet 1700-0003_PowerBoard_REV-A_0; LibraryName: TTECH; DeviceSetName: RES_0402_VISHAY; MANUFACTURER_PART_NUMBER: CRCW040210K0FKEDC
R7 R14 R51-R53 = RES_0805_STACKPOLE: as R19 on sheet 1700-0003_PowerBoard_REV-A_0; LibraryName: TTECH; DeviceSetName: RES_0805_STACKPOLE; COPYRIGHT: Copyright (C) 2022 Ultra Librarian. All rights reserved.; MANUFACTURER: STACKPOLE
R39 R49 = RES_0603_STACKPOLE: MANUFACTURER: TECONN; MANUFACTURER_PART_NUMBER: CPF0603B30KE1; PART_DESC: RES SMD 30K OHM 0.1% 1/16W 0603; GateName_1: A; SymbolName_1: RES; LibraryName: TTECH; DeviceSetName: RES_0603_STACKPOLE; COPYRIGHT: Copyright (C) 2022 Ultra Librarian. All rights reserved.
R40 R42 R45 R48 = RES_0603_STACKPOLE: as R30 on sheet 1700-0003_PowerBoard_REV-A_0; LibraryName: TTECH; DeviceSetName: RES_0603_STACKPOLE; COPYRIGHT: Copyright (C) 2022 Ultra Librarian. All rights reserved.; MANUFACTURER: STACKPOLE
R41 R44 R47 R50 = RES_0603_STACKPOLE: MANUFACTURER: TECONN; MANUFACTURER_PART_NUMBER: CPF0603F100RC1; PART_DESC: RES SMD 100 OHM 1% 1/16W 0603; GateName_1: A; SymbolName_1: RES; LibraryName: TTECH; DeviceSetName: RES_0603_STACKPOLE; COPYRIGHT: Copyright (C) 2022 Ultra Librarian. All rights reserved.
R43 = RES_0603_STACKPOLE: MANUFACTURER: TECONN; MANUFACTURER_PART_NUMBER: CPF0603B15KE1; PART_DESC: RES SMD 15K OHM 0.1% 1/16W 0603; GateName_1: A; SymbolName_1: RES; LibraryName: TTECH; DeviceSetName: RES_0603_STACKPOLE; COPYRIGHT: Copyright (C) 2022 Ultra Librarian. All rights reserved.
R46 = RES_0603_STACKPOLE: MANUFACTURER: TECONN; MANUFACTURER_PART_NUMBER: CPF0603B18KE1; PART_DESC: RES SMD 18K OHM 0.1% 1/16W 0603; GateName_1: A; SymbolName_1: RES; LibraryName: TTECH; DeviceSetName: RES_0603_STACKPOLE; COPYRIGHT: Copyright (C) 2022 Ultra Librarian. All rights reserved.
U12-U15 = IC_OPAMP_TI_OPA363AIDBVR: PART_DESC: IC OPAMP GP 1 CIRCUIT SOT23-6; GateName_1: A; SymbolName_1: OPA363_DBV_6; LibraryName: TTECH; DeviceSetName: IC_OPAMP_TI_OPA363AIDBVR; COPYRIGHT: Copyright (C) 2022 Ultra Librarian. All rights reserved.; PACKAGE: (SOT23-6)
U17 = PIC18F6627T-E/PT: PART_DESC: IC MCU 8BIT 96KB FLASH 64TQFP; GateName_1: A; SymbolName_1: PIC18F6627-X/PT; LibraryName: TTECH; DeviceSetName: PIC18F6627T-E/PT; MANUFACTURER_PART_NUMBER: PIC18F6627T-E/PT

## Nets that join several sheets
GND: 1700-0003_PowerBoard_REV-A_0 (70 pins), 1700-0003_PowerBoard_REV-A_1 (35 pins)
~{12V_EN}: 1700-0003_PowerBoard_REV-A_0 (R63.1), 1700-0003_PowerBoard_REV-A_1 (!12VEN.P$1 U17.18)
~{5V_EN}: 1700-0003_PowerBoard_REV-A_0 (R60.1), 1700-0003_PowerBoard_REV-A_1 (!5VEN.P$2)
5V: 1700-0003_PowerBoard_REV-A_0 (12 pins), 1700-0003_PowerBoard_REV-A_1 (R42.1)
5V_OK: 1700-0003_PowerBoard_REV-A_0 (5VOK.P$1), 1700-0003_PowerBoard_REV-A_1 (U17.1)
5VPIC: 1700-0003_PowerBoard_REV-A_0 (5 pins), 1700-0003_PowerBoard_REV-A_1 (30 pins)
~{CHRGR_INT}: 1700-0003_PowerBoard_REV-A_0 (U1.11), 1700-0003_PowerBoard_REV-A_1 (!INT!.P$2 R1.2 U17.33)
CHRGR_SCL: 1700-0003_PowerBoard_REV-A_0 (U1.13), 1700-0003_PowerBoard_REV-A_1 (R2.2 SCL.P$2 U17.34)
CHRGR_SDA: 1700-0003_PowerBoard_REV-A_0 (U1.14), 1700-0003_PowerBoard_REV-A_1 (R3.2 SDA.P$2 U17.35)
DCIN_S: 1700-0003_PowerBoard_REV-A_0 (10 pins), 1700-0003_PowerBoard_REV-A_1 (R39.1)
IB_PWR_EN: 1700-0003_PowerBoard_REV-A_0 (IBPWREN.P$1 R38.1), 1700-0003_PowerBoard_REV-A_1 (U17.15)
IB_SPI_MISO: 1700-0003_PowerBoard_REV-A_0 (J4.4 MISO.P$1), 1700-0003_PowerBoard_REV-A_1 (U17.52)
IB_SPI_MOSI: 1700-0003_PowerBoard_REV-A_0 (J4.3 MOSI.P$1), 1700-0003_PowerBoard_REV-A_1 (U17.51)
IB_SPI_~{SS}: 1700-0003_PowerBoard_REV-A_0 (!SPI_SS!.P$1 J4.6), 1700-0003_PowerBoard_REV-A_1 (U17.49)
IB_SPI_SCLK: 1700-0003_PowerBoard_REV-A_0 (J4.5 SPI_CLK.P$1), 1700-0003_PowerBoard_REV-A_1 (U17.50)
PC_PWR_12V: 1700-0003_PowerBoard_REV-A_0 (12 pins), 1700-0003_PowerBoard_REV-A_1 (R49.1)
PSW_OUT: 1700-0003_PowerBoard_REV-A_0 (5 pins), 1700-0003_PowerBoard_REV-A_1 (R46.1)
STAT_LED_~{RED}/GRN: 1700-0003_PowerBoard_REV-A_0 (U7.2), 1700-0003_PowerBoard_REV-A_1 (U17.47)
STAT_LED_RED/~{GRN}: 1700-0003_PowerBoard_REV-A_0 (U7.1), 1700-0003_PowerBoard_REV-A_1 (U17.48)
VBATSW_EN: 1700-0003_PowerBoard_REV-A_0 (R28.1 VBATSWEN.P$1), 1700-0003_PowerBoard_REV-A_1 (U17.46)